# EAGLE schematic 6502_nes_book (EAGLE 6.4), part 5 of 5
## Sheet 27 of 29
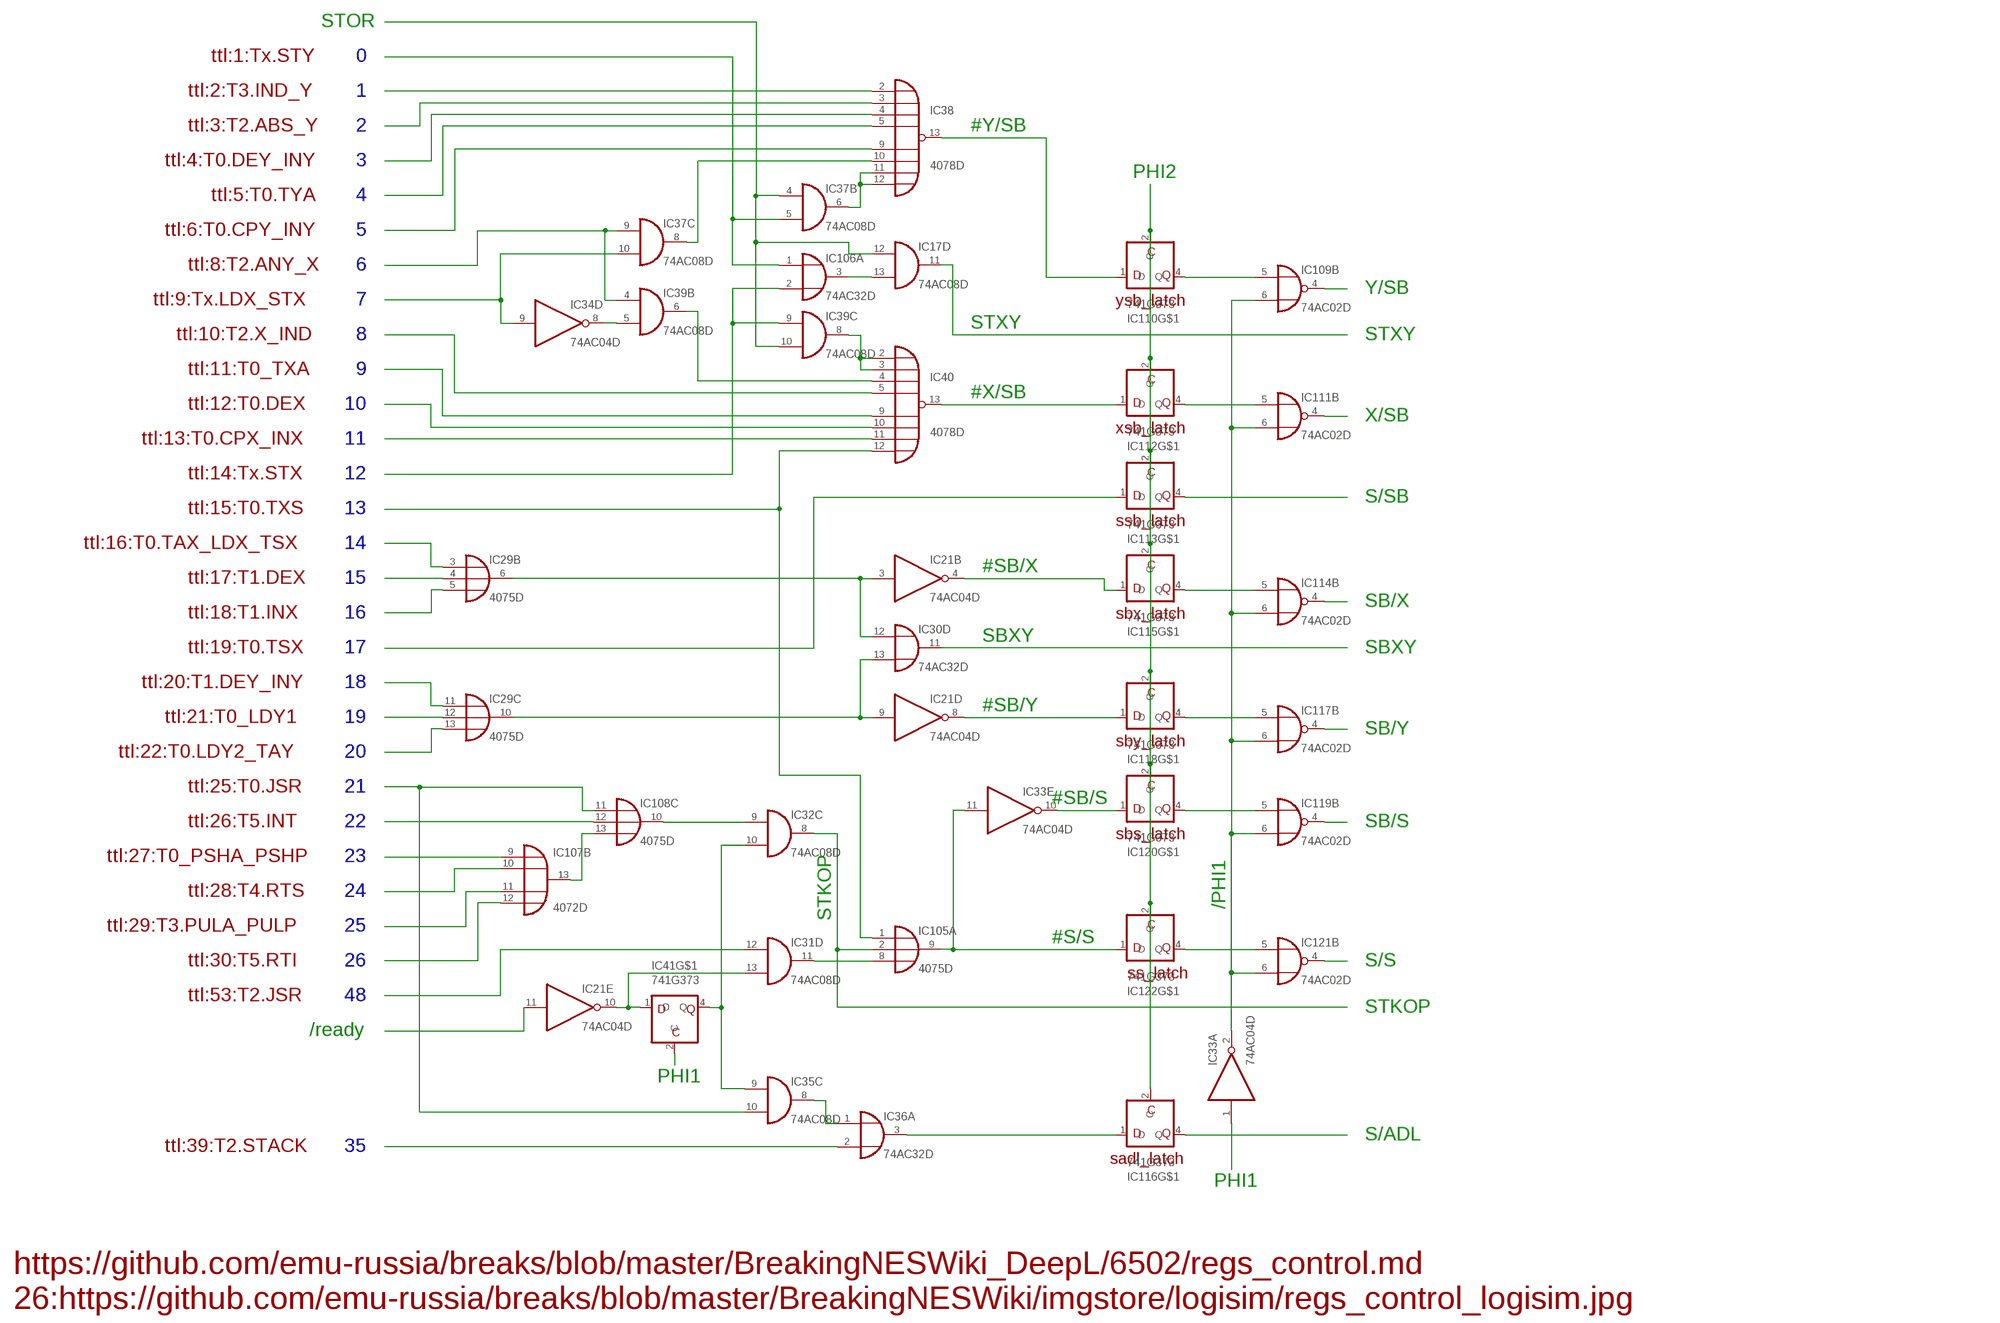
[diagram p35: schematic, sheet 27]

### Parts
IC17  74AC08D  [SO14]
IC21  74AC04D  [SO14]
IC29  4075D  [SO14]
IC30  74AC32D  [SO14]
IC31  74AC08D  [SO14]
IC32  74AC08D  [SO14]
IC33  74AC04D  [SO14]
IC34  74AC04D  [SO14]
IC35  74AC08D  [SO14]
IC36  74AC32D  [SO14]
IC37  74AC08D  [SO14]
IC38  4078D  [SO14]
IC39  74AC08D  [SO14]
IC40  4078D  [SO14]
IC41  741G373  [DBV-R-PDSO-G5]
IC105  4075D  [SO14]
IC106  74AC32D  [SO14]
IC107  4072D  [SO14]
IC108  4075D  [SO14]
IC109  74AC02D  [SO14]
IC110  741G373  [DBV-R-PDSO-G5]
IC111  74AC02D  [SO14]
IC112  741G373  [DBV-R-PDSO-G5]
IC113  741G373  [DBV-R-PDSO-G5]
IC114  74AC02D  [SO14]
IC115  741G373  [DBV-R-PDSO-G5]
IC116  741G373  [DBV-R-PDSO-G5]
IC117  74AC02D  [SO14]
IC118  741G373  [DBV-R-PDSO-G5]
IC119  74AC02D  [SO14]
IC120  741G373  [DBV-R-PDSO-G5]
IC121  74AC02D  [SO14]
IC122  741G373  [DBV-R-PDSO-G5]

### Nets
N$29: IC38.2(I0)
N$33: IC38.3(I1)
N$36: IC38.5(I3)
N$38: IC38.9(I4)
N$39: IC34.9(D:I) IC37.10(C:I1)
N$42: IC34.8(D:O) IC39.5(B:I1)
N$45: IC37.9(C:I0) IC39.4(B:I0)
N$49: IC40.5(I3)
N$50: IC40.9(I4)
N$51: IC40.10(I5)
N$52: IC40.11(I6)
N$53: IC29.3(B:I0)
N$54: IC29.4(B:I1)
N$55: IC29.5(B:I2)
N$56: IC29.13(C:I2)
N$57: IC29.12(C:I1)
N$58: IC29.11(C:I0)
N$59: IC108.12(C:I1)
N$60: IC107.9(B:I0)
N$61: IC35.10(C:I1) IC108.11(C:I0)
N$62: IC107.11(B:I2)
N$63: IC107.10(B:I1)
N$64: IC21.3(B:I) IC29.6(B:O) IC30.12(D:I0)
N$65: IC21.9(D:I) IC29.10(C:O) IC30.13(D:I1)
N$66: IC113.1(D)
N$67: IC36.2(A:I1)
N$68: IC36.3(A:O) IC116.1(D)
N$201: IC31.11(D:O) IC105.8(A:I2)
N$202: IC33.11(E:I) IC105.9(A:O) IC122.1(D)
N$203: IC41.2(C)
N$204: IC32.10(C:I1) IC35.9(C:I0) IC41.4(Q)
N$205: IC33.10(E:O) IC120.1(D)
N$206: IC35.8(C:O) IC36.1(A:I0)
N$207: IC38.13(J) IC110.1(D)
N$208: IC37.6(B:O) IC38.11(I6) IC38.12(I7)
N$209: IC37.8(C:O) IC38.10(I5)
N$210: IC40.13(J) IC112.1(D)
N$211: IC32.9(C:I0) IC108.10(C:O)
N$212: IC21.10(E:O) IC31.13(D:I1) IC41.1(D)
N$213: IC40.12(I7) IC105.1(A:I0)
N$214: IC21.4(B:O) IC115.1(D)
N$215: IC21.8(D:O) IC118.1(D)
N$216: IC31.12(D:I0)
N$217: IC37.5(B:I1) IC106.1(A:I0)
N$218: IC39.9(C:I0) IC106.2(A:I1)
N$219: IC17.13(D:I1) IC106.3(A:O)
N$220: IC39.8(C:O) IC40.2(I0) IC40.3(I1)
N$221: IC39.6(B:O) IC40.4(I2)
N$222: IC107.12(B:I3)
N$223: IC21.11(E:I)
N$224: IC107.13(B:O) IC108.13(C:I2)
N$225: IC30.11(D:O)
N$226: IC32.8(C:O) IC105.2(A:I1)
N$227: IC17.12(D:I0) IC37.4(B:I0) IC39.10(C:I1)
N$228: IC38.4(I2)
N$229: IC109.5(B:I0) IC110.4(Q)
N$230: IC109.4(B:O)
N$231: IC111.5(B:I0) IC112.4(Q)
N$232: IC111.4(B:O)
N$233: IC114.5(B:I0) IC115.4(Q)
N$234: IC114.4(B:O)
N$235: IC116.4(Q)
N$236: IC117.5(B:I0) IC118.4(Q)
N$237: IC117.4(B:O)
N$238: IC119.5(B:I0) IC120.4(Q)
N$239: IC119.4(B:O)
N$240: IC121.5(B:I0) IC122.4(Q)
N$241: IC121.4(B:O)
N$242: IC113.4(Q)
N$243: IC110.2(C) IC112.2(C) IC113.2(C) IC115.2(C) IC116.2(C) IC118.2(C) IC120.2(C) IC122.2(C)
N$244: IC17.11(D:O)
N$272: IC33.2(A:O) IC109.6(B:I1) IC111.6(B:I1) IC114.6(B:I1) IC117.6(B:I1) IC119.6(B:I1) IC121.6(B:I1)
N$273: IC33.1(A:I)
Unconnected: IC17.1(A:I0) IC17.2(A:I1) IC17.3(A:O) IC17.4(B:I0) IC17.5(B:I1) IC17.6(B:O) IC17.8(C:O) IC17.9(C:I0) IC17.10(C:I1) IC21.1(A:I) IC21.2(A:O) IC21.5(C:I) IC21.6(C:O) IC21.12(F:O) IC21.13(F:I) IC29.1(A:I0) IC29.2(A:I1) IC29.8(A:I2) IC29.9(A:O) IC30.1(A:I0) IC30.2(A:I1) IC30.3(A:O) IC30.4(B:I0) IC30.5(B:I1) IC30.6(B:O) IC30.8(C:O) IC30.9(C:I0) IC30.10(C:I1) IC31.1(A:I0) IC31.2(A:I1) IC31.3(A:O) IC31.4(B:I0) IC31.5(B:I1) IC31.6(B:O) IC31.8(C:O) IC31.9(C:I0) IC31.10(C:I1) IC32.1(A:I0) IC32.2(A:I1) IC32.3(A:O) IC32.4(B:I0) IC32.5(B:I1) IC32.6(B:O) IC32.11(D:O) IC32.12(D:I0) IC32.13(D:I1) IC33.3(B:I) IC33.4(B:O) IC33.5(C:I) IC33.6(C:O) IC33.8(D:O) IC33.9(D:I) IC33.12(F:O) IC33.13(F:I) IC34.1(A:I) IC34.2(A:O) IC34.3(B:I) IC34.4(B:O) IC34.5(C:I) IC34.6(C:O) IC34.10(E:O) IC34.11(E:I) IC34.12(F:O) IC34.13(F:I) IC35.1(A:I0) IC35.2(A:I1) IC35.3(A:O) IC35.4(B:I0) IC35.5(B:I1) IC35.6(B:O) IC35.11(D:O) IC35.12(D:I0) IC35.13(D:I1) IC36.4(B:I0) IC36.5(B:I1) IC36.6(B:O) IC36.8(C:O) IC36.9(C:I0) IC36.10(C:I1) IC36.11(D:O) IC36.12(D:I0) IC36.13(D:I1) IC37.1(A:I0) IC37.2(A:I1) IC37.3(A:O) IC37.11(D:O) IC37.12(D:I0) IC37.13(D:I1) IC39.1(A:I0) IC39.2(A:I1) IC39.3(A:O) IC39.11(D:O) IC39.12(D:I0) IC39.13(D:I1) IC105.3(B:I0) IC105.4(B:I1) IC105.5(B:I2) IC105.6(B:O) IC105.10(C:O) IC105.11(C:I0) IC105.12(C:I1) IC105.13(C:I2) IC106.4(B:I0) IC106.5(B:I1) IC106.6(B:O) IC106.8(C:O) IC106.9(C:I0) IC106.10(C:I1) IC106.11(D:O) IC106.12(D:I0) IC106.13(D:I1) IC107.1(A:O) IC107.2(A:I0) IC107.3(A:I1) IC107.4(A:I2) IC107.5(A:I3) IC108.1(A:I0) IC108.2(A:I1) IC108.3(B:I0) IC108.4(B:I1) IC108.5(B:I2) IC108.6(B:O) IC108.8(A:I2) IC108.9(A:O) IC109.1(A:O) IC109.2(A:I0) IC109.3(A:I1) IC109.8(C:I0) IC109.9(C:I1) IC109.10(C:O) IC109.11(D:I0) IC109.12(D:I1) IC109.13(D:O) IC111.1(A:O) IC111.2(A:I0) IC111.3(A:I1) IC111.8(C:I0) IC111.9(C:I1) IC111.10(C:O) IC111.11(D:I0) IC111.12(D:I1) IC111.13(D:O) IC114.1(A:O) IC114.2(A:I0) IC114.3(A:I1) IC114.8(C:I0) IC114.9(C:I1) IC114.10(C:O) IC114.11(D:I0) IC114.12(D:I1) IC114.13(D:O) IC117.1(A:O) IC117.2(A:I0) IC117.3(A:I1) IC117.8(C:I0) IC117.9(C:I1) IC117.10(C:O) IC117.11(D:I0) IC117.12(D:I1) IC117.13(D:O) IC119.1(A:O) IC119.2(A:I0) IC119.3(A:I1) IC119.8(C:I0) IC119.9(C:I1) IC119.10(C:O) IC119.11(D:I0) IC119.12(D:I1) IC119.13(D:O) IC121.1(A:O) IC121.2(A:I0) IC121.3(A:I1) IC121.8(C:I0) IC121.9(C:I1) IC121.10(C:O) IC121.11(D:I0) IC121.12(D:I1) IC121.13(D:O)

### Notes on the sheet
- STOR
- ttl:1:Tx.STY | 0
- ttl:2:T3.IND_Y | 1
- ttl:3:T2.ABS_Y | 2 | #Y/SB
- ttl:4:T0.DEY_INY | 3
- PHI2
- ttl:5:T0.TYA | 4
- ttl:6:T0.CPY_INY | 5
- ttl:8:T2.ANY_X | 6
- Y/SB
- ttl:9:Tx.LDX_STX | 7 | ysb_latch
- STXY
- ttl:10:T2.X_IND | 8 | STXY
- ttl:11:T0_TXA | 9
- #X/SB
- ttl:12:T0.DEX | 10
- X/SB
- xsb_latch
- ttl:13:T0.CPX_INX | 11
- ttl:14:Tx.STX | 12
- S/SB
- ttl:15:T0.TXS | 13
- ssb_latch
- ttl:16:T0.TAX_LDX_TSX | 14
- #SB/X
- ttl:17:T1.DEX | 15
- SB/X
- ttl:18:T1.INX | 16 | sbx_latch
- SBXY
- ttl:19:T0.TSX | 17 | SBXY
- ttl:20:T1.DEY_INY | 18
- #SB/Y
- ttl:21:T0_LDY1 | 19
- SB/Y
- sby_latch
- ttl:22:T0.LDY2_TAY | 20
- ttl:25:T0.JSR | 21
- #SB/S
- ttl:26:T5.INT | 22 | SB/S
- sbs_latch
- ttl:27:T0_PSHA_PSHP | 23
- ttl:28:T4.RTS | 24
- /PHI1
- STKOP
- ttl:29:T3.PULA_PULP | 25
- #S/S
- ttl:30:T5.RTI | 26 | S/S
- ss_latch
- ttl:53:T2.JSR | 48
- STKOP
- /ready
- PHI1
- S/ADL
- ttl:39:T2.STACK | 35
- sadl_latch
- PHI1
- https://github.com/emu-russia/breaks/blob/master/BreakingNESWiki_DeepL/6502/regs_control.md
  26:https://github.com/emu-russia/breaks/blob/master/BreakingNESWiki/imgstore/logisim/regs_control_logisim.jpg

## Sheet 28 of 29
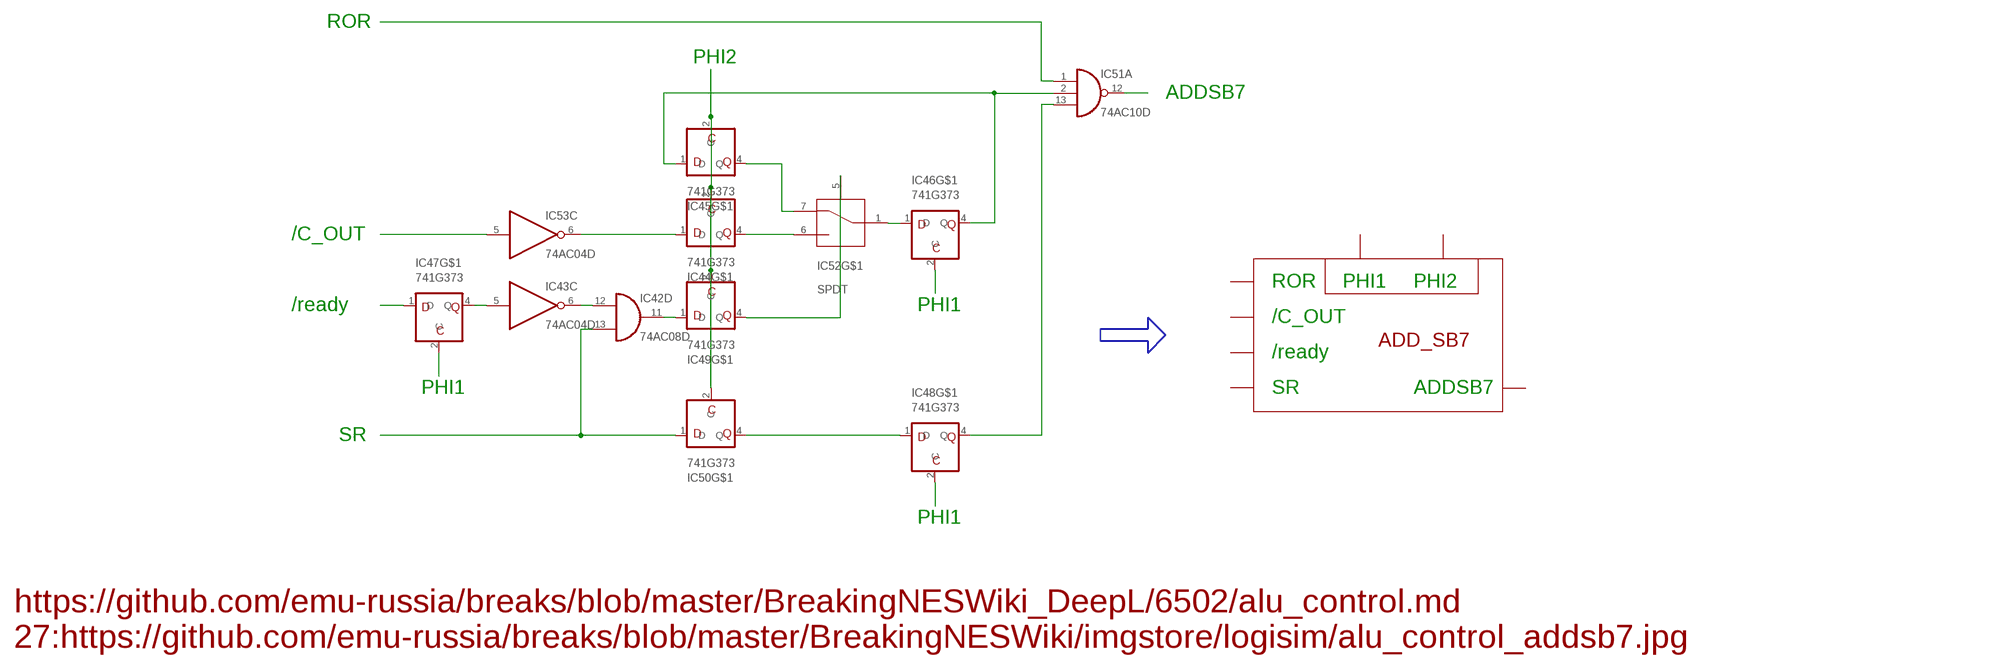
[diagram p36: schematic, sheet 28]

### Parts
IC42  74AC08D  [SO14]
IC43  74AC04D  [SO14]
IC44  741G373  [DBV-R-PDSO-G5]
IC45  741G373  [DBV-R-PDSO-G5]
IC46  741G373  [DBV-R-PDSO-G5]
IC47  741G373  [DBV-R-PDSO-G5]
IC48  741G373  [DBV-R-PDSO-G5]
IC49  741G373  [DBV-R-PDSO-G5]
IC50  741G373  [DBV-R-PDSO-G5]
IC51  74AC10D  [SO14]
IC52  SPDT  [SO8]
IC53  74AC04D  [SO14]

### Nets
N$69: IC51.12(A:O)
N$70: IC45.1(D) IC46.4(Q) IC51.2(A:I1)
N$71: IC51.1(A:I0)
N$72: IC44.2(C) IC45.2(C) IC49.2(C) IC50.2(C)
N$73: IC44.4(Q) IC52.6(NO)
N$74: IC44.1(D) IC53.6(C:O)
N$75: IC42.11(D:O) IC49.1(D)
N$76: IC49.4(Q) IC52.5(A)
N$77: IC47.2(C)
N$78: IC46.2(C)
N$79: IC46.1(D) IC52.1(Q)
N$80: IC45.4(Q) IC52.7(NC)
N$81: IC48.4(Q) IC51.13(A:I2)
N$82: IC48.2(C)
N$83: IC48.1(D) IC50.4(Q)
N$84: IC47.1(D)
N$85: IC42.12(D:I0) IC43.6(C:O)
N$86: IC43.5(C:I) IC47.4(Q)
N$87: IC42.13(D:I1) IC50.1(D)
N$88: IC53.5(C:I)
Unconnected: IC42.1(A:I0) IC42.2(A:I1) IC42.3(A:O) IC42.4(B:I0) IC42.5(B:I1) IC42.6(B:O) IC42.8(C:O) IC42.9(C:I0) IC42.10(C:I1) IC43.1(A:I) IC43.2(A:O) IC43.3(B:I) IC43.4(B:O) IC43.8(D:O) IC43.9(D:I) IC43.10(E:O) IC43.11(E:I) IC43.12(F:O) IC43.13(F:I) IC51.3(B:I0) IC51.4(B:I1) IC51.5(B:I2) IC51.6(B:O) IC51.8(C:O) IC51.9(C:I0) IC51.10(C:I1) IC51.11(C:I2) IC53.1(A:I) IC53.2(A:O) IC53.3(B:I) IC53.4(B:O) IC53.8(D:O) IC53.9(D:I) IC53.10(E:O) IC53.11(E:I) IC53.12(F:O) IC53.13(F:I)

### Buses
B$12

### Notes on the sheet
- ROR
- PHI2
- ADDSB7
- /C_OUT
- ROR | PHI1 | PHI2
- /ready | PHI1
- /C_OUT
- ADD_SB7
- /ready
- PHI1 | SR | ADDSB7
- SR
- PHI1
- https://github.com/emu-russia/breaks/blob/master/BreakingNESWiki_DeepL/6502/alu_control.md
  27:https://github.com/emu-russia/breaks/blob/master/BreakingNESWiki/imgstore/logisim/alu_control_addsb7.jpg

## Sheet 29 of 29
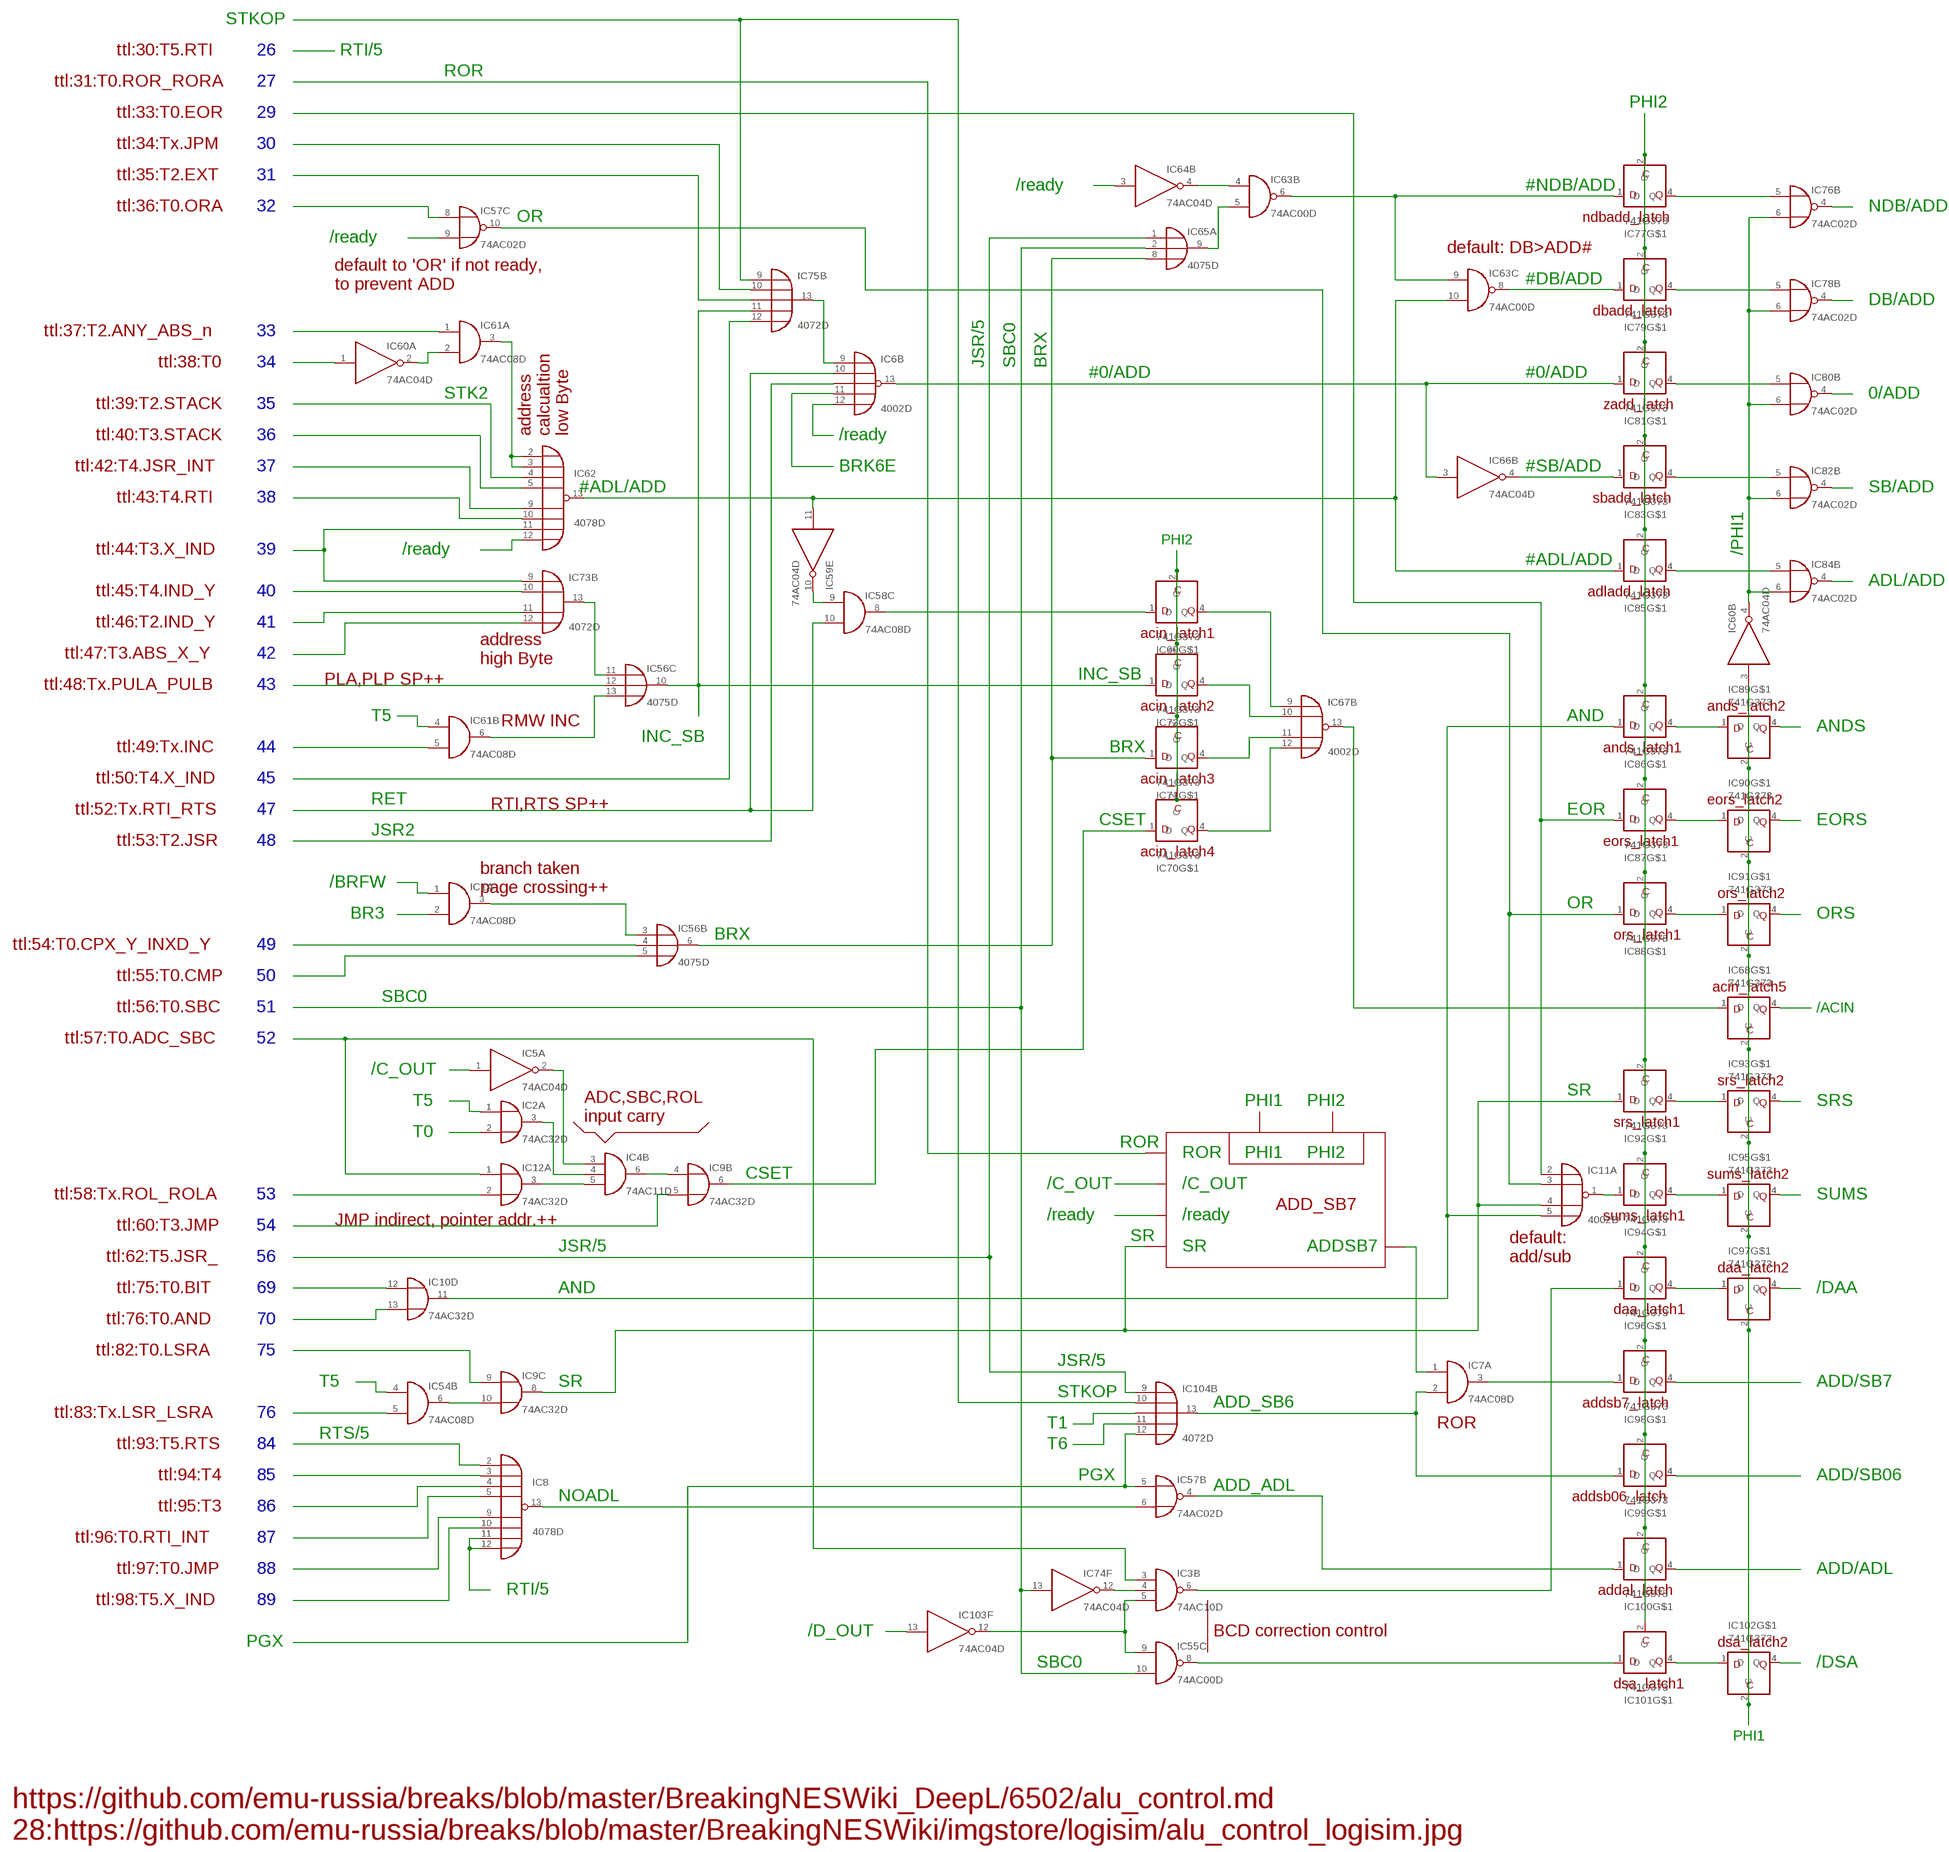
[diagram p37: schematic, sheet 29]

### Parts
IC1  74AC08D  [SO14]
IC2  74AC32D  [SO14]
IC3  74AC10D  [SO14]
IC4  74AC11D  [SO14]
IC5  74AC04D  [SO14]
IC6  4002D  [SO14]
IC7  74AC08D  [SO14]
IC8  4078D  [SO14]
IC9  74AC32D  [SO14]
IC10  74AC32D  [SO14]
IC11  4002D  [SO14]
IC12  74AC32D  [SO14]
IC54  74AC08D  [SO14]
IC55  74AC00D  [SO14]
IC56  4075D  [SO14]
IC57  74AC02D  [SO14]
IC58  74AC08D  [SO14]
IC59  74AC04D  [SO14]
IC60  74AC04D  [SO14]
IC61  74AC08D  [SO14]
IC62  4078D  [SO14]
IC63  74AC00D  [SO14]
IC64  74AC04D  [SO14]
IC65  4075D  [SO14]
IC66  74AC04D  [SO14]
IC67  4002D  [SO14]
IC68  741G373  [DBV-R-PDSO-G5]
IC69  741G373  [DBV-R-PDSO-G5]
IC70  741G373  [DBV-R-PDSO-G5]
IC71  741G373  [DBV-R-PDSO-G5]
IC72  741G373  [DBV-R-PDSO-G5]
IC73  4072D  [SO14]
IC74  74AC04D  [SO14]
IC75  4072D  [SO14]
IC76  74AC02D  [SO14]
IC77  741G373  [DBV-R-PDSO-G5]
IC78  74AC02D  [SO14]
IC79  741G373  [DBV-R-PDSO-G5]
IC80  74AC02D  [SO14]
IC81  741G373  [DBV-R-PDSO-G5]
IC82  74AC02D  [SO14]
IC83  741G373  [DBV-R-PDSO-G5]
IC84  74AC02D  [SO14]
IC85  741G373  [DBV-R-PDSO-G5]
IC86  741G373  [DBV-R-PDSO-G5]
IC87  741G373  [DBV-R-PDSO-G5]
IC88  741G373  [DBV-R-PDSO-G5]
IC89  741G373  [DBV-R-PDSO-G5]
IC90  741G373  [DBV-R-PDSO-G5]
IC91  741G373  [DBV-R-PDSO-G5]
IC92  741G373  [DBV-R-PDSO-G5]
IC93  741G373  [DBV-R-PDSO-G5]
IC94  741G373  [DBV-R-PDSO-G5]
IC95  741G373  [DBV-R-PDSO-G5]
IC96  741G373  [DBV-R-PDSO-G5]
IC97  741G373  [DBV-R-PDSO-G5]
IC98  741G373  [DBV-R-PDSO-G5]
IC99  741G373  [DBV-R-PDSO-G5]
IC100  741G373  [DBV-R-PDSO-G5]
IC101  741G373  [DBV-R-PDSO-G5]
IC102  741G373  [DBV-R-PDSO-G5]
IC103  74AC04D  [SO14]
IC104  4072D  [SO14]

### Nets
N$3: IC60.4(B:O) IC76.6(B:I1) IC78.6(B:I1) IC80.6(B:I1) IC82.6(B:I1) IC84.6(B:I1)
N$6: IC8.9(I4)
N$7: IC8.5(I3)
N$8: IC8.4(I2)
N$9: IC8.3(I1)
N$10: IC8.2(I0)
N$11: IC8.10(I5)
N$12: IC1.3(A:O) IC56.3(B:I0)
N$13: IC4.3(B:I0) IC5.2(A:O)
N$14: IC2.3(A:O) IC4.4(B:I1)
N$15: IC2.2(A:I1)
N$16: IC3.3(B:I0) IC12.1(A:I0)
N$17: IC10.13(D:I1)
N$18: IC10.12(D:I0)
N$19: IC9.9(C:I0)
N$20: IC54.5(B:I1)
N$31: IC4.6(B:O) IC9.4(B:I0)
N$47: IC9.5(B:I1)
N$89: IC57.5(B:I0) IC104.12(B:I3)
N$90: IC3.5(B:I2) IC55.9(C:I0) IC103.12(F:O)
N$91: IC3.6(B:O) IC96.1(D)
N$92: IC55.8(C:O) IC101.1(D)
N$93: IC4.5(B:I2) IC12.3(A:O)
N$94: IC9.10(C:I1) IC54.6(B:O)
N$95: IC59.11(E:I) IC62.13(J) IC63.10(C:I1) IC85.1(D)
N$96: IC60.1(A:I)
N$97: IC62.5(I3)
N$98: IC62.9(I4)
N$99: IC62.10(I5)
N$100: IC73.10(B:I1)
N$101: IC73.11(B:I2)
N$102: IC73.12(B:I3)
N$103: IC56.12(C:I1)
N$104: IC61.5(B:I1)
N$105: IC60.2(A:O) IC61.2(A:I1)
N$106: IC61.1(A:I0)
N$107: IC57.8(C:I0)
N$109: IC75.10(B:I1)
N$110: IC75.12(B:I3)
N$112: IC56.5(B:I2)
N$113: IC56.4(B:I1)
N$114: IC62.12(I7)
N$115: IC11.2(A:I0) IC87.1(D)
N$116: IC69.2(C) IC70.2(C) IC71.2(C) IC72.2(C)
N$117: IC56.10(C:O) IC72.1(D) IC75.11(B:I2)
N$118: IC67.12(B:I3) IC70.4(Q)
N$119: IC67.10(B:I1) IC72.4(Q)
N$120: IC67.11(B:I2) IC71.4(Q)
N$121: IC67.9(B:I0) IC69.4(Q)
N$122: IC67.13(B:O) IC68.1(D)
N$123: IC9.6(B:O) IC70.1(D)
N$124: IC56.6(B:O) IC65.8(A:I2) IC71.1(D)
N$125: IC63.6(B:O) IC63.9(C:I0) IC77.1(D)
N$126: IC63.4(B:I0) IC64.4(B:O)
N$127: IC64.3(B:I)
N$128: IC8.13(J) IC57.6(B:I1)
N$130: IC63.8(C:O) IC79.1(D)
N$131: IC6.13(B:O) IC66.3(B:I) IC81.1(D)
N$132: IC66.4(B:O) IC83.1(D)
N$133: IC10.11(D:O) IC11.5(A:I3) IC86.1(D)
N$134: IC11.3(A:I1) IC57.10(C:O) IC88.1(D)
N$135: IC68.4(Q)
N$136: IC57.9(C:I1)
N$137: IC61.3(A:O) IC62.2(I0) IC62.3(I1)
N$138: IC56.13(C:I2) IC61.6(B:O)
N$139: IC63.5(B:I1) IC65.9(A:O)
N$140: IC58.9(C:I0) IC59.10(E:O)
N$141: IC56.11(C:I0) IC73.13(B:O)
N$143: IC3.4(B:I1) IC74.12(F:O)
N$144: IC65.1(A:I0) IC104.9(B:I0)
N$145: IC62.4(I2)
N$146: IC55.10(C:I1) IC65.2(A:I1) IC74.13(F:I)
N$147: IC1.2(A:I1)
N$148: IC1.1(A:I0)
N$149: IC12.2(A:I1)
N$150: IC62.11(I6) IC73.9(B:I0)
N$151: IC58.8(C:O) IC69.1(D)
N$152: IC6.10(B:I1) IC58.10(C:I1)
N$153: IC6.9(B:I0) IC75.13(B:O)
N$154: IC9.8(C:O) IC11.4(A:I2) IC92.1(D)
N$155: IC61.4(B:I0)
N$156: IC76.5(B:I0) IC77.4(Q)
N$157: IC76.4(B:O)
N$158: IC78.5(B:I0) IC79.4(Q)
N$159: IC78.4(B:O)
N$160: IC80.5(B:I0) IC81.4(Q)
N$161: IC80.4(B:O)
N$162: IC82.5(B:I0) IC83.4(Q)
N$163: IC82.4(B:O)
N$164: IC84.5(B:I0) IC85.4(Q)
N$165: IC84.4(B:O)
N$166: IC77.2(C) IC79.2(C) IC81.2(C) IC83.2(C) IC85.2(C) IC86.2(C) IC87.2(C) IC88.2(C) IC92.2(C) IC94.2(C) IC96.2(C) IC98.2(C) IC99.2(C) IC100.2(C) IC101.2(C)
N$167: IC6.11(B:I2)
N$168: IC88.4(Q) IC91.1(D)
N$169: IC87.4(Q) IC90.1(D)
N$170: IC86.4(Q) IC89.1(D)
N$171: IC89.4(Q)
N$172: IC90.4(Q)
N$173: IC91.4(Q)
N$174: IC2.1(A:I0)
N$175: IC5.1(A:I)
N$176: IC54.4(B:I0)
N$177: IC8.11(I6) IC8.12(I7)
N$178: IC92.4(Q) IC93.1(D)
N$179: IC93.4(Q)
N$180: IC94.4(Q) IC95.1(D)
N$181: IC95.4(Q)
N$182: IC96.4(Q) IC97.1(D)
N$183: IC97.4(Q)
N$184: IC101.4(Q) IC102.1(D)
N$185: IC102.4(Q)
N$186: IC98.4(Q)
N$187: IC99.4(Q)
N$188: IC100.4(Q)
N$189: IC103.13(F:I)
N$190: IC57.4(B:O) IC100.1(D)
N$191: IC7.2(A:I1) IC99.1(D) IC104.13(B:O)
N$192: IC75.9(B:I0) IC104.10(B:I1)
N$194: IC104.11(B:I2)
N$195: IC7.3(A:O) IC98.1(D)
N$198: IC7.1(A:I0)
N$199: IC11.1(A:O) IC94.1(D)
N$200: IC60.3(B:I) IC68.2(C) IC89.2(C) IC90.2(C) IC91.2(C) IC93.2(C) IC95.2(C) IC97.2(C) IC102.2(C)
NNET9: IC6.12(B:I3)
Unconnected: IC1.4(B:I0) IC1.5(B:I1) IC1.6(B:O) IC1.8(C:O) IC1.9(C:I0) IC1.10(C:I1) IC1.11(D:O) IC1.12(D:I0) IC1.13(D:I1) IC2.4(B:I0) IC2.5(B:I1) IC2.6(B:O) IC2.8(C:O) IC2.9(C:I0) IC2.10(C:I1) IC2.11(D:O) IC2.12(D:I0) IC2.13(D:I1) IC3.1(A:I0) IC3.2(A:I1) IC3.8(C:O) IC3.9(C:I0) IC3.10(C:I1) IC3.11(C:I2) IC3.12(A:O) IC3.13(A:I2) IC4.1(A:I0) IC4.2(A:I1) IC4.8(C:O) IC4.9(C:I0) IC4.10(C:I1) IC4.11(C:I2) IC4.12(A:O) IC4.13(A:I2) IC5.3(B:I) IC5.4(B:O) IC5.5(C:I) IC5.6(C:O) IC5.8(D:O) IC5.9(D:I) IC5.10(E:O) IC5.11(E:I) IC5.12(F:O) IC5.13(F:I) IC6.1(A:O) IC6.2(A:I0) IC6.3(A:I1) IC6.4(A:I2) IC6.5(A:I3) IC7.4(B:I0) IC7.5(B:I1) IC7.6(B:O) IC7.8(C:O) IC7.9(C:I0) IC7.10(C:I1) IC7.11(D:O) IC7.12(D:I0) IC7.13(D:I1) IC9.1(A:I0) IC9.2(A:I1) IC9.3(A:O) IC9.11(D:O) IC9.12(D:I0) IC9.13(D:I1) IC10.1(A:I0) IC10.2(A:I1) IC10.3(A:O) IC10.4(B:I0) IC10.5(B:I1) IC10.6(B:O) IC10.8(C:O) IC10.9(C:I0) IC10.10(C:I1) IC11.9(B:I0) IC11.10(B:I1) IC11.11(B:I2) IC11.12(B:I3) IC11.13(B:O) IC12.4(B:I0) IC12.5(B:I1) IC12.6(B:O) IC12.8(C:O) IC12.9(C:I0) IC12.10(C:I1) IC12.11(D:O) IC12.12(D:I0) IC12.13(D:I1) IC54.1(A:I0) IC54.2(A:I1) IC54.3(A:O) IC54.8(C:O) IC54.9(C:I0) IC54.10(C:I1) IC54.11(D:O) IC54.12(D:I0) IC54.13(D:I1) IC55.1(A:I0) IC55.2(A:I1) IC55.3(A:O) IC55.4(B:I0) IC55.5(B:I1) IC55.6(B:O) IC55.11(D:O) IC55.12(D:I0) IC55.13(D:I1) IC56.1(A:I0) IC56.2(A:I1) IC56.8(A:I2) IC56.9(A:O) IC57.1(A:O) IC57.2(A:I0) IC57.3(A:I1) IC57.11(D:I0) IC57.12(D:I1) IC57.13(D:O) IC58.1(A:I0) IC58.2(A:I1) IC58.3(A:O) IC58.4(B:I0) IC58.5(B:I1) IC58.6(B:O) IC58.11(D:O) IC58.12(D:I0) IC58.13(D:I1) IC59.1(A:I) IC59.2(A:O) IC59.3(B:I) IC59.4(B:O) IC59.5(C:I) IC59.6(C:O) IC59.8(D:O) IC59.9(D:I) IC59.12(F:O) IC59.13(F:I) IC60.5(C:I) IC60.6(C:O) IC60.8(D:O) IC60.9(D:I) IC60.10(E:O) IC60.11(E:I) IC60.12(F:O) IC60.13(F:I) IC61.8(C:O) IC61.9(C:I0) IC61.10(C:I1) IC61.11(D:O) IC61.12(D:I0) IC61.13(D:I1) IC63.1(A:I0) IC63.2(A:I1) IC63.3(A:O) IC63.11(D:O) IC63.12(D:I0) IC63.13(D:I1) IC64.1(A:I) IC64.2(A:O) IC64.5(C:I) IC64.6(C:O) IC64.8(D:O) IC64.9(D:I) IC64.10(E:O) IC64.11(E:I) IC64.12(F:O) IC64.13(F:I) IC65.3(B:I0) IC65.4(B:I1) IC65.5(B:I2) IC65.6(B:O) IC65.10(C:O) IC65.11(C:I0) IC65.12(C:I1) IC65.13(C:I2) IC66.1(A:I) IC66.2(A:O) IC66.5(C:I) IC66.6(C:O) IC66.8(D:O) IC66.9(D:I) IC66.10(E:O) IC66.11(E:I) IC66.12(F:O) IC66.13(F:I) IC67.1(A:O) IC67.2(A:I0) IC67.3(A:I1) IC67.4(A:I2) IC67.5(A:I3) IC73.1(A:O) IC73.2(A:I0) IC73.3(A:I1) IC73.4(A:I2) IC73.5(A:I3) IC74.1(A:I) IC74.2(A:O) IC74.3(B:I) IC74.4(B:O) IC74.5(C:I) IC74.6(C:O) IC74.8(D:O) IC74.9(D:I) IC74.10(E:O) IC74.11(E:I) IC75.1(A:O) IC75.2(A:I0) IC75.3(A:I1) IC75.4(A:I2) IC75.5(A:I3) IC76.1(A:O) IC76.2(A:I0) IC76.3(A:I1) IC76.8(C:I0) IC76.9(C:I1) IC76.10(C:O) IC76.11(D:I0) IC76.12(D:I1) IC76.13(D:O) IC78.1(A:O) IC78.2(A:I0) IC78.3(A:I1) IC78.8(C:I0) IC78.9(C:I1) IC78.10(C:O) IC78.11(D:I0) IC78.12(D:I1) IC78.13(D:O) IC80.1(A:O) IC80.2(A:I0) IC80.3(A:I1) IC80.8(C:I0) IC80.9(C:I1) IC80.10(C:O) IC80.11(D:I0) IC80.12(D:I1) IC80.13(D:O) IC82.1(A:O) IC82.2(A:I0) IC82.3(A:I1) IC82.8(C:I0) IC82.9(C:I1) IC82.10(C:O) IC82.11(D:I0) IC82.12(D:I1) IC82.13(D:O) IC84.1(A:O) IC84.2(A:I0) IC84.3(A:I1) IC84.8(C:I0) IC84.9(C:I1) IC84.10(C:O) IC84.11(D:I0) IC84.12(D:I1) IC84.13(D:O) IC103.1(A:I) IC103.2(A:O) IC103.3(B:I) IC103.4(B:O) IC103.5(C:I) IC103.6(C:O) IC103.8(D:O) IC103.9(D:I) IC103.10(E:O) IC103.11(E:I) IC104.1(A:O) IC104.2(A:I0) IC104.3(A:I1) IC104.4(A:I2) IC104.5(A:I3)

### Notes on the sheet
- STKOP
- ttl:30:T5.RTI | 26 | RTI/5
- ROR
- ttl:31:T0.ROR_RORA | 27
- PHI2
- ttl:33:T0.EOR | 29
- ttl:34:Tx.JPM | 30
- ttl:35:T2.EXT | 31
- /ready | #NDB/ADD
- ttl:36:T0.ORA | 32 | NDB/ADD
- OR | ndbadd_latch
- /ready
- default: DB>ADD#
- #DB/ADD
- default to 'OR' if not ready,
  to prevent ADD
- DB/ADD
- dbadd_latch
- ttl:37:T2.ANY_ABS_n | 33
- ttl:38:T0 | 34 | JSR/5 | SBC0 | BRX
- #0/ADD | #0/ADD
- STK2 | 0/ADD
- ttl:39:T2.STACK | 35 | zadd_latch
- address
  calcualtion
  low Byte
- ttl:40:T3.STACK | 36 | /ready
- ttl:42:T4.JSR_INT | 37 | BRK6E | #SB/ADD
- #ADL/ADD | SB/ADD
- ttl:43:T4.RTI | 38 | sbadd_latch
- PHI2
- ttl:44:T3.X_IND | 39 | /ready | /PHI1
- #ADL/ADD
- ADL/ADD
- ttl:45:T4.IND_Y | 40 | adladd_latch
- ttl:46:T2.IND_Y | 41
- acin_latch1
- ttl:47:T3.ABS_X_Y | 42
- address
  high Byte
- INC_SB
- PLA,PLP SP++
- ttl:48:Tx.PULA_PULB | 43
- acin_latch2 | ands_latch2
- T5 | AND
- RMW INC
- ANDS
- INC_SB
- ttl:49:Tx.INC | 44 | BRX | ands_latch1
- ttl:50:T4.X_IND | 45 | acin_latch3
- RET | eors_latch2
- RTI,RTS SP++
- ttl:52:Tx.RTI_RTS | 47 | EOR
- CSET | EORS
- JSR2
- ttl:53:T2.JSR | 48 | eors_latch1
- acin_latch4
- /BRFW
- branch taken
  page crossing++
- ors_latch2
- OR
- BR3 | ORS
- BRX | ors_latch1
- ttl:54:T0.CPX_Y_INXD_Y | 49
- ttl:55:T0.CMP | 50
- acin_latch5
- SBC0
- ttl:56:T0.SBC | 51 | /ACIN
- ttl:57:T0.ADC_SBC | 52
- /C_OUT
- srs_latch2
- SR
- T5 | PHI1 | PHI2 | SRS
- ADC,SBC,ROL
  input carry
- srs_latch1
- T0
- ROR
- ROR | PHI1 | PHI2
- CSET | sums_latch2
- /C_OUT | /C_OUT
- ttl:58:Tx.ROL_ROLA | 53 | SUMS
- ADD_SB7
- /ready | /ready | sums_latch1
- JMP indirect, pointer addr.++
- ttl:60:T3.JMP | 54
- SR
- JSR/5 | SR | ADDSB7
- ttl:62:T5.JSR_ | 56
- default:
  add/sub
- daa_latch2
- ttl:75:T0.BIT | 69 | AND | /DAA
- daa_latch1
- ttl:76:T0.AND | 70
- ttl:82:T0.LSRA | 75
- JSR/5
- T5 | SR | ADD/SB7
- STKOP
- ADD_SB6 | addsb7_latch
- ttl:83:Tx.LSR_LSRA | 76
- T1 | ROR
- RTS/5
- ttl:93:T5.RTS | 84 | T6
- ttl:94:T4 | 85 | PGX | ADD/SB06
- ADD_ADL
- NOADL | addsb06_latch
- ttl:95:T3 | 86
- ttl:96:T0.RTI_INT | 87
- ttl:97:T0.JMP | 88 | ADD/ADL
- RTI/5 | addal_latch
- ttl:98:T5.X_IND | 89
- /D_OUT | BCD correction control
- PGX | dsa_latch2
- SBC0 | /DSA
- dsa_latch1
- PHI1
- https://github.com/emu-russia/breaks/blob/master/BreakingNESWiki_DeepL/6502/alu_control.md
  28:https://github.com/emu-russia/breaks/blob/master/BreakingNESWiki/imgstore/logisim/alu_control_logisim.jpg

## Power pins joined to a net without a drawn wire
GND: IC1.7(P:GND) IC2.7(P:GND) IC3.7(P:GND) IC4.7(P:GND) IC5.7(P:GND) IC7.7(P:GND) IC9.7(P:GND) IC10.7(P:GND) IC12.7(P:GND) IC13.7(P:GND) IC14.7(P:GND) IC15.7(P:GND) IC16.7(P:GND) IC17.7(P:GND) IC19.7(P:GND) IC20.7(P:GND) IC21.7(P:GND) IC22.7(P:GND) IC23.7(P:GND) IC26.7(P:GND) IC27.7(P:GND) IC28.7(P:GND) IC30.7(P:GND) IC31.7(P:GND) IC32.7(P:GND) IC33.7(P:GND) IC34.7(P:GND) IC35.7(P:GND) IC36.7(P:GND) IC37.7(P:GND) IC39.7(P:GND) IC41.3(GND) IC42.7(P:GND) IC43.7(P:GND) IC44.3(GND) IC45.3(GND) IC46.3(GND) IC47.3(GND) IC48.3(GND) IC49.3(GND) IC50.3(GND) IC51.7(P:GND) IC52.2(GND) IC52.3(GND) IC52.4(GND) IC53.7(P:GND) IC54.7(P:GND) IC55.7(P:GND) IC57.7(P:GND) IC58.7(P:GND) IC59.7(P:GND) IC60.7(P:GND) IC61.7(P:GND) IC63.7(P:GND) IC64.7(P:GND) IC66.7(P:GND) IC68.3(GND) IC69.3(GND) IC70.3(GND) IC71.3(GND) IC72.3(GND) IC74.7(P:GND) IC76.7(P:GND) IC77.3(GND) IC78.7(P:GND) IC79.3(GND) IC80.7(P:GND) IC81.3(GND) IC82.7(P:GND) IC83.3(GND) IC84.7(P:GND) IC85.3(GND) IC86.3(GND) IC87.3(GND) IC88.3(GND) IC89.3(GND) IC90.3(GND) IC91.3(GND) IC92.3(GND) IC93.3(GND) IC94.3(GND) IC95.3(GND) IC96.3(GND) IC97.3(GND) IC98.3(GND) IC99.3(GND) IC100.3(GND) IC101.3(GND) IC102.3(GND) IC103.7(P:GND) IC106.7(P:GND) IC109.7(P:GND) IC110.3(GND) IC111.7(P:GND) IC112.3(GND) IC113.3(GND) IC114.7(P:GND) IC115.3(GND) IC116.3(GND) IC117.7(P:GND) IC118.3(GND) IC119.7(P:GND) IC120.3(GND) IC121.7(P:GND) IC122.3(GND) IC123.7(P:GND) IC124.7(P:GND) IC125.7(P:GND) IC126.3(GND) IC127.7(P:GND) IC130.7(P:GND) IC131.3(GND) IC133.3(GND) IC141.7(P:GND) IC144.3(GND) IC153.3(GND) IC154.3(GND) IC155.7(P:GND) IC157.3(GND) IC158.3(GND) IC159.3(GND) IC160.3(GND) IC161.3(GND) IC162.7(P:GND) IC163.3(GND) IC164.7(P:GND) IC165.3(GND) IC166.7(P:GND) IC167.3(GND) IC169.7(P:GND) IC189.7(P:GND) IC190.7(P:GND) IC198.7(P:GND) IC5089.7(P:GND) IC5183.7(P:GND) IC5184.7(P:GND) IC5185.7(P:GND) IC5191.7(P:GND) IC5196.7(P:GND) IC5203.7(P:GND) IC5206.3(GND) IC5212.3(GND) IC5217.7(P:GND) IC5220.7(P:GND) IC5231.7(P:GND) IC5234.7(P:GND) IC5240.7(P:GND) IC5242.7(P:GND) IC5247.7(P:GND) IC5252.3(GND) IC5257.3(GND) IC5805.3(GND) IC5808.3(GND) IC5809.3(GND) IC5810.7(P:GND) IC5815.7(P:GND) IC5847.3(GND) IC5968.3(GND) IC5991.3(GND) IC6023.7(P:GND) IC6043.7(P:GND) IC6063.3(GND) IC6075.3(GND) IC6101.3(GND) IC6102.3(GND) IC6103.7(P:GND) IC6105.7(P:GND) IC6106.7(P:GND) IC6107.7(P:GND) IC6108.7(P:GND) IC6109.3(GND) IC6110.3(GND) IC6111.7(P:GND) IC6112.2(GND) IC6112.3(GND) IC6112.4(GND) IC6113.7(P:GND) IC6114.3(GND) IC6115.7(P:GND) IC6116.7(P:GND) IC6125.7(P:GND) IC6126.7(P:GND) IC6127.7(P:GND) IC6128.7(P:GND) IC6129.7(P:GND) IC6130.7(P:GND) IC6131.7(P:GND) IC6132.7(P:GND) IC6134.7(P:GND) IC6135.7(P:GND) IC6140.7(P:GND) IC6141.7(P:GND) IC6142.7(P:GND) IC6143.7(P:GND) IC6144.7(P:GND) IC6145.7(P:GND) IC6146.7(P:GND) IC6147.7(P:GND) IC6148.3(GND) IC6149.3(GND) IC6153.7(P:GND) IC6154.7(P:GND) IC6155.7(P:GND) IC6156.7(P:GND) IC6165.7(P:GND) IC6166.7(P:GND) IC6167.7(P:GND) IC6168.7(P:GND) IC6169.3(GND) IC6170.3(GND) IC6171.7(P:GND) IC6172.7(P:GND) IC6173.7(P:GND) IC6174.7(P:GND) IC6175.7(P:GND) IC6176.7(P:GND) IC6177.7(P:GND) IC6179.7(P:GND) IC6180.7(P:GND) IC6181.7(P:GND) IC6182.7(P:GND) IC6183.7(P:GND) IC6184.7(P:GND) IC6185.7(P:GND) IC6186.7(P:GND) IC6187.7(P:GND) IC6188.3(GND) IC6189.7(P:GND) IC6190.7(P:GND) IC6191.7(P:GND) IC6192.7(P:GND) IC6193.7(P:GND) IC6195.7(P:GND) IC6196.7(P:GND) IC6198.7(P:GND) IC6199.7(P:GND) IC6200.7(P:GND) IC6201.7(P:GND) IC6202.7(P:GND) IC6203.7(P:GND) IC6204.7(P:GND) IC6205.7(P:GND) IC6206.7(P:GND) IC6207.7(P:GND) IC6208.7(P:GND) IC6209.7(P:GND) IC6211.7(P:GND) IC6212.7(P:GND) IC6214.7(P:GND) IC6215.7(P:GND) IC6216.7(P:GND) IC6217.7(P:GND) IC6218.7(P:GND) IC6219.7(P:GND) IC6220.7(P:GND) IC6221.7(P:GND) IC6222.3(GND) IC6223.3(GND) IC6224.7(P:GND) IC6227.7(P:GND) IC6228.7(P:GND) IC6229.7(P:GND) IC6230.7(P:GND) IC6231.7(P:GND) IC6232.7(P:GND) IC6233.7(P:GND) IC6234.7(P:GND) IC6235.7(P:GND) IC6236.3(GND) IC6237.3(GND) IC6238.3(GND) IC6239.7(P:GND) IC6240.7(P:GND) IC6241.7(P:GND) IC6242.7(P:GND) IC6243.7(P:GND) IC6244.7(P:GND) IC6245.7(P:GND) IC6246.3(GND) IC6247.3(GND) IC6248.3(GND) IC6249.7(P:GND) IC6250.7(P:GND) IC6251.7(P:GND) IC6252.7(P:GND) IC6253.7(P:GND) IC6254.7(P:GND) IC6255.3(GND) IC6256.7(P:GND) IC6257.7(P:GND) IC6258.7(P:GND) IC6259.7(P:GND) IC6260.7(P:GND) IC6261.7(P:GND) IC6262.7(P:GND) IC6263.7(P:GND) IC6265.3(GND) IC6266.3(GND) IC6267.2(GND) IC6267.3(GND) IC6267.4(GND) IC6268.7(P:GND) IC6269.7(P:GND) IC6270.7(P:GND) IC6272.3(GND) IC6273.3(GND) IC6274.7(P:GND) IC6275.7(P:GND) IC6276.7(P:GND) IC6277.7(P:GND) IC6279.7(P:GND) IC6280.7(P:GND) IC6281.7(P:GND) IC6282.3(GND) IC6284.7(P:GND) IC6285.3(GND) IC6286.7(P:GND) IC6287.3(GND) IC6288.3(GND) IC6289.7(P:GND) IC6290.3(GND) IC6291.3(GND) IC6292.3(GND) IC6294.3(GND) IC6295.3(GND) IC6296.3(GND) IC6297.3(GND) IC6298.3(GND) IC6299.2(GND) IC6299.3(GND) IC6299.4(GND) IC6300.7(P:GND) IC6301.2(GND) IC6301.3(GND) IC6301.4(GND) IC6302.7(P:GND) IC6303.2(GND) IC6303.3(GND) IC6303.4(GND) IC6304.7(P:GND) IC6305.2(GND) IC6305.3(GND) IC6305.4(GND) IC6306.7(P:GND) IC6307.7(P:GND) IC6308.3(GND) IC6309.7(P:GND) IC6311.3(GND) IC6312.7(P:GND) IC6313.3(GND) IC6314.2(GND) IC6314.3(GND) IC6314.4(GND) IC6316.7(P:GND) IC6317.7(P:GND) IC6318.7(P:GND) IC6319.7(P:GND) IC6320.7(P:GND) IC6321.7(P:GND) IC6322.7(P:GND) IC6323.7(P:GND) IC6324.7(P:GND) IC6325.7(P:GND) IC6326.7(P:GND) IC6328.7(P:GND) IC6329.7(P:GND) IC6330.7(P:GND) IC6331.7(P:GND) IC6332.3(GND) IC6333.7(P:GND) IC6334.3(GND) IC6335.3(GND) IC6336.3(GND) IC6337.7(P:GND) IC6338.3(GND) IC6340.7(P:GND) IC6341.7(P:GND) IC6342.7(P:GND) IC6343.3(GND) IC6344.7(P:GND) IC6345.3(GND) IC6346.3(GND) IC6347.3(GND) IC6348.3(GND) IC6349.3(GND) IC6353.7(P:GND) IC6354.3(GND) IC6355.7(P:GND) IC6356.7(P:GND) IC6357.7(P:GND) IC6358.3(GND) IC6359.3(GND) IC6365.7(P:GND) IC6368.7(P:GND) IC6370.3(GND) IC6371.3(GND) IC6372.3(GND) IC6373.7(P:GND) IC6380.7(P:GND) IC6381.7(P:GND) IC6382.7(P:GND) IC6383.3(GND) IC6387.7(P:GND) IC6390.7(P:GND) IC6391.7(P:GND) IC6392.7(P:GND) IC6393.7(P:GND) IC6394.7(P:GND) IC6395.3(GND) IC6396.7(P:GND) IC6397.7(P:GND) IC6399.7(P:GND) IC6400.7(P:GND) IC6401.7(P:GND) IC6402.7(P:GND) IC6403.7(P:GND) IC6404.7(P:GND) IC6405.7(P:GND) IC6406.7(P:GND) IC6407.7(P:GND) IC6408.7(P:GND) IC6409.3(GND) IC6410.7(P:GND) IC6411.7(P:GND) IC6412.3(GND) IC6413.3(GND) IC6414.7(P:GND) IC6415.3(GND) IC6416.7(P:GND) IC6418.3(GND) IC6419.7(P:GND) IC6420.3(GND) IC6421.7(P:GND) IC6422.3(GND) IC6423.3(GND) IC6424.3(GND) IC6425.3(GND) IC6426.3(GND) IC6427.3(GND) IC6428.7(P:GND) IC6429.7(P:GND) IC6430.7(P:GND) IC6431.7(P:GND) IC6432.3(GND) IC6433.3(GND) IC6434.3(GND) IC6435.3(GND) IC6436.3(GND) IC6437.3(GND) IC6438.7(P:GND) IC6439.7(P:GND) IC6440.7(P:GND) IC6441.7(P:GND) IC6442.3(GND) IC6443.3(GND) IC6444.3(GND) IC6445.3(GND) IC6446.3(GND) IC6447.7(P:GND) IC6449.3(GND) IC6450.7(P:GND) IC6451.7(P:GND) IC6452.3(GND) IC6453.7(P:GND) IC6454.3(GND) IC6455.3(GND) IC6456.3(GND) IC6457.7(P:GND) IC6458.7(P:GND) IC6459.7(P:GND) IC6460.7(P:GND) IC6461.7(P:GND) IC6462.7(P:GND) IC6463.7(P:GND) IC6464.7(P:GND) IC6465.7(P:GND) IC6466.7(P:GND) IC6467.7(P:GND) IC6468.7(P:GND) IC6469.7(P:GND) IC6470.3(GND) IC6471.3(GND) IC6472.3(GND) IC6473.3(GND) IC6474.3(GND) IC6475.3(GND) IC6476.3(GND) IC6477.3(GND) IC6478.7(P:GND) IC6479.7(P:GND) IC6480.3(GND) IC6481.3(GND) IC6482.3(GND) IC6483.3(GND) IC6484.7(P:GND) IC6485.7(P:GND) IC6493.7(P:GND) IC6494.3(GND) IC6507.3(GND) IC6514.3(GND) IC6515.7(P:GND) IC6516.7(P:GND) IC6520.7(P:GND) IC6532.7(P:GND) IC6536.3(GND) IC6537.7(P:GND) IC6538.7(P:GND) IC6547.3(GND) IC6548.3(GND) IC6549.7(P:GND) IC6550.3(GND) IC6552.3(GND) IC6553.7(P:GND) IC6554.3(GND) IC6555.3(GND) IC6556.7(P:GND) IC6557.3(GND) IC6558.7(P:GND) IC6559.3(GND) IC6560.3(GND) IC6561.7(P:GND) IC6562.3(GND) IC6567.7(P:GND) IC6572.7(P:GND) IC6573.7(P:GND) IC6574.7(P:GND) IC6575.7(P:GND) IC6576.7(P:GND) IC6579.7(P:GND) IC6580.7(P:GND) IC6581.7(P:GND) IC6582.7(P:GND) IC6584.7(P:GND) IC6586.7(P:GND) IC6587.7(P:GND) IC6592.7(P:GND) IC6593.7(P:GND) IC6594.7(P:GND) IC6596.7(P:GND) IC6600.7(P:GND) IC6602.7(P:GND) IC6603.7(P:GND) IC6607.3(GND) IC6608.7(P:GND) IC6612.7(P:GND) IC6613.7(P:GND) IC6614.7(P:GND) IC6616.7(P:GND) IC6617.7(P:GND) IC6618.7(P:GND) IC6620.7(P:GND) IC6621.7(P:GND) IC6622.7(P:GND) IC6623.7(P:GND) IC6626.3(GND) IC6627.3(GND) IC6628.3(GND) IC6629.3(GND) IC6630.3(GND) IC6631.3(GND) IC6632.3(GND) IC6633.3(GND) IC6634.3(GND) IC6635.3(GND) IC6636.7(P:GND) IC6638.3(GND) IC6642.7(P:GND) IC6643.3(GND) IC6644.3(GND) IC6645.3(GND) IC6646.3(GND) IC6647.3(GND) IC6648.3(GND) IC6649.3(GND) IC6650.3(GND) IC6651.3(GND) IC6652.3(GND) IC6653.3(GND) IC6655.3(GND) IC6656.3(GND) IC6657.3(GND) IC6658.3(GND) IC6665.7(P:GND) IC6681.3(GND) IC6682.3(GND) IC6691.7(P:GND) IC6706.7(P:GND) IC6707.7(P:GND) IC6719.2(GND) IC6719.3(GND) IC6719.4(GND) IC6747.3(GND) IC6748.7(P:GND) IC6749.7(P:GND) IC6750.7(P:GND) IC6751.7(P:GND) IC6752.7(P:GND) IC6753.3(GND) IC6754.7(P:GND) IC6770.7(P:GND) IC6779.3(GND) IC6786.7(P:GND) IC6787.7(P:GND) IC6796.7(P:GND) IC6797.7(P:GND) IC6798.7(P:GND) IC6799.7(P:GND) IC6800.3(GND) IC6801.3(GND) IC6802.3(GND) IC6803.3(GND) IC6804.3(GND) IC6805.7(P:GND) IC6807.7(P:GND) IC6808.3(GND) IC6809.3(GND) IC6811.2(GND) IC6811.3(GND) IC6811.4(GND) IC6812.2(GND) IC6812.3(GND) IC6812.4(GND) IC6814.7(P:GND) IC6815.3(GND) IC6820.3(GND) IC6821.3(GND) IC6827.7(P:GND) IC6828.7(P:GND) IC6829.7(P:GND) IC6830.3(GND) IC6831.7(P:GND) IC6832.7(P:GND) IC6833.3(GND) IC6834.7(P:GND) IC6835.3(GND) IC6836.7(P:GND) IC6837.3(GND) IC6847.7(P:GND) IC6848.7(P:GND) IC6849.7(P:GND) IC6850.7(P:GND) IC6851.7(P:GND) IC6852.7(P:GND) IC6853.3(GND) IC6865.7(P:GND) IC6866.7(P:GND) IC6867.7(P:GND) IC6868.3(GND) IC6869.7(P:GND) IC6870.7(P:GND) IC6871.3(GND) IC6872.7(P:GND) IC6873.3(GND) IC6874.3(GND)
VCC: IC1.14(P:VCC) IC2.14(P:VCC) IC3.14(P:VCC) IC4.14(P:VCC) IC5.14(P:VCC) IC7.14(P:VCC) IC9.14(P:VCC) IC10.14(P:VCC) IC12.14(P:VCC) IC13.14(P:VCC) IC14.14(P:VCC) IC15.14(P:VCC) IC16.14(P:VCC) IC17.14(P:VCC) IC19.14(P:VCC) IC20.14(P:VCC) IC21.14(P:VCC) IC22.14(P:VCC) IC23.14(P:VCC) IC26.14(P:VCC) IC27.14(P:VCC) IC28.14(P:VCC) IC30.14(P:VCC) IC31.14(P:VCC) IC32.14(P:VCC) IC33.14(P:VCC) IC34.14(P:VCC) IC35.14(P:VCC) IC36.14(P:VCC) IC37.14(P:VCC) IC39.14(P:VCC) IC41.5(VCC) IC42.14(P:VCC) IC43.14(P:VCC) IC44.5(VCC) IC45.5(VCC) IC46.5(VCC) IC47.5(VCC) IC48.5(VCC) IC49.5(VCC) IC50.5(VCC) IC51.14(P:VCC) IC52.8(VCC) IC53.14(P:VCC) IC54.14(P:VCC) IC55.14(P:VCC) IC57.14(P:VCC) IC58.14(P:VCC) IC59.14(P:VCC) IC60.14(P:VCC) IC61.14(P:VCC) IC63.14(P:VCC) IC64.14(P:VCC) IC66.14(P:VCC) IC68.5(VCC) IC69.5(VCC) IC70.5(VCC) IC71.5(VCC) IC72.5(VCC) IC74.14(P:VCC) IC76.14(P:VCC) IC77.5(VCC) IC78.14(P:VCC) IC79.5(VCC) IC80.14(P:VCC) IC81.5(VCC) IC82.14(P:VCC) IC83.5(VCC) IC84.14(P:VCC) IC85.5(VCC) IC86.5(VCC) IC87.5(VCC) IC88.5(VCC) IC89.5(VCC) IC90.5(VCC) IC91.5(VCC) IC92.5(VCC) IC93.5(VCC) IC94.5(VCC) IC95.5(VCC) IC96.5(VCC) IC97.5(VCC) IC98.5(VCC) IC99.5(VCC) IC100.5(VCC) IC101.5(VCC) IC102.5(VCC) IC103.14(P:VCC) IC106.14(P:VCC) IC109.14(P:VCC) IC110.5(VCC) IC111.14(P:VCC) IC112.5(VCC) IC113.5(VCC) IC114.14(P:VCC) IC115.5(VCC) IC116.5(VCC) IC117.14(P:VCC) IC118.5(VCC) IC119.14(P:VCC) IC120.5(VCC) IC121.14(P:VCC) IC122.5(VCC) IC123.14(P:VCC) IC124.14(P:VCC) IC125.14(P:VCC) IC126.5(VCC) IC127.14(P:VCC) IC130.14(P:VCC) IC131.5(VCC) IC133.5(VCC) IC141.14(P:VCC) IC144.5(VCC) IC153.5(VCC) IC154.5(VCC) IC155.14(P:VCC) IC157.5(VCC) IC158.5(VCC) IC159.5(VCC) IC160.5(VCC) IC161.5(VCC) IC162.14(P:VCC) IC163.5(VCC) IC164.14(P:VCC) IC165.5(VCC) IC166.14(P:VCC) IC167.5(VCC) IC169.14(P:VCC) IC189.14(P:VCC) IC190.14(P:VCC) IC198.14(P:VCC) IC5089.14(P:VCC) IC5183.14(P:VCC) IC5184.14(P:VCC) IC5185.14(P:VCC) IC5191.14(P:VCC) IC5196.14(P:VCC) IC5203.14(P:VCC) IC5206.5(VCC) IC5212.5(VCC) IC5217.14(P:VCC) IC5220.14(P:VCC) IC5231.14(P:VCC) IC5234.14(P:VCC) IC5240.14(P:VCC) IC5242.14(P:VCC) IC5247.14(P:VCC) IC5252.5(VCC) IC5257.5(VCC) IC5805.5(VCC) IC5808.5(VCC) IC5809.5(VCC) IC5810.14(P:VCC) IC5815.14(P:VCC) IC5847.5(VCC) IC5968.5(VCC) IC5991.5(VCC) IC6023.14(P:VCC) IC6043.14(P:VCC) IC6063.5(VCC) IC6075.5(VCC) IC6101.5(VCC) IC6102.5(VCC) IC6103.14(P:VCC) IC6105.14(P:VCC) IC6106.14(P:VCC) IC6107.14(P:VCC) IC6108.14(P:VCC) IC6109.5(VCC) IC6110.5(VCC) IC6111.14(P:VCC) IC6112.8(VCC) IC6113.14(P:VCC) IC6114.5(VCC) IC6115.14(P:VCC) IC6116.14(P:VCC) IC6125.14(P:VCC) IC6126.14(P:VCC) IC6127.14(P:VCC) IC6128.14(P:VCC) IC6129.14(P:VCC) IC6130.14(P:VCC) IC6131.14(P:VCC) IC6132.14(P:VCC) IC6134.14(P:VCC) IC6135.14(P:VCC) IC6140.14(P:VCC) IC6141.14(P:VCC) IC6142.14(P:VCC) IC6143.14(P:VCC) IC6144.14(P:VCC) IC6145.14(P:VCC) IC6146.14(P:VCC) IC6147.14(P:VCC) IC6148.5(VCC) IC6149.5(VCC) IC6153.14(P:VCC) IC6154.14(P:VCC) IC6155.14(P:VCC) IC6156.14(P:VCC) IC6165.14(P:VCC) IC6166.14(P:VCC) IC6167.14(P:VCC) IC6168.14(P:VCC) IC6169.5(VCC) IC6170.5(VCC) IC6171.14(P:VCC) IC6172.14(P:VCC) IC6173.14(P:VCC) IC6174.14(P:VCC) IC6175.14(P:VCC) IC6176.14(P:VCC) IC6177.14(P:VCC) IC6179.14(P:VCC) IC6180.14(P:VCC) IC6181.14(P:VCC) IC6182.14(P:VCC) IC6183.14(P:VCC) IC6184.14(P:VCC) IC6185.14(P:VCC) IC6186.14(P:VCC) IC6187.14(P:VCC) IC6188.5(VCC) IC6189.14(P:VCC) IC6190.14(P:VCC) IC6191.14(P:VCC) IC6192.14(P:VCC) IC6193.14(P:VCC) IC6195.14(P:VCC) IC6196.14(P:VCC) IC6198.14(P:VCC) IC6199.14(P:VCC) IC6200.14(P:VCC) IC6201.14(P:VCC) IC6202.14(P:VCC) IC6203.14(P:VCC) IC6204.14(P:VCC) IC6205.14(P:VCC) IC6206.14(P:VCC) IC6207.14(P:VCC) IC6208.14(P:VCC) IC6209.14(P:VCC) IC6211.14(P:VCC) IC6212.14(P:VCC) IC6214.14(P:VCC) IC6215.14(P:VCC) IC6216.14(P:VCC) IC6217.14(P:VCC) IC6218.14(P:VCC) IC6219.14(P:VCC) IC6220.14(P:VCC) IC6221.14(P:VCC) IC6222.5(VCC) IC6223.5(VCC) IC6224.14(P:VCC) IC6227.14(P:VCC) IC6228.14(P:VCC) IC6229.14(P:VCC) IC6230.14(P:VCC) IC6231.14(P:VCC) IC6232.14(P:VCC) IC6233.14(P:VCC) IC6234.14(P:VCC) IC6235.14(P:VCC) IC6236.5(VCC) IC6237.5(VCC) IC6238.5(VCC) IC6239.14(P:VCC) IC6240.14(P:VCC) IC6241.14(P:VCC) IC6242.14(P:VCC) IC6243.14(P:VCC) IC6244.14(P:VCC) IC6245.14(P:VCC) IC6246.5(VCC) IC6247.5(VCC) IC6248.5(VCC) IC6249.14(P:VCC) IC6250.14(P:VCC) IC6251.14(P:VCC) IC6252.14(P:VCC) IC6253.14(P:VCC) IC6254.14(P:VCC) IC6255.5(VCC) IC6256.14(P:VCC) IC6257.14(P:VCC) IC6258.14(P:VCC) IC6259.14(P:VCC) IC6260.14(P:VCC) IC6261.14(P:VCC) IC6262.14(P:VCC) IC6263.14(P:VCC) IC6265.5(VCC) IC6266.5(VCC) IC6267.8(VCC) IC6268.14(P:VCC) IC6269.14(P:VCC) IC6270.14(P:VCC) IC6272.5(VCC) IC6273.5(VCC) IC6274.14(P:VCC) IC6275.14(P:VCC) IC6276.14(P:VCC) IC6277.14(P:VCC) IC6279.14(P:VCC) IC6280.14(P:VCC) IC6281.14(P:VCC) IC6282.5(VCC) IC6284.14(P:VCC) IC6285.5(VCC) IC6286.14(P:VCC) IC6287.5(VCC) IC6288.5(VCC) IC6289.14(P:VCC) IC6290.5(VCC) IC6291.5(VCC) IC6292.5(VCC) IC6294.5(VCC) IC6295.5(VCC) IC6296.5(VCC) IC6297.5(VCC) IC6298.5(VCC) IC6299.8(VCC) IC6300.14(P:VCC) IC6301.8(VCC) IC6302.14(P:VCC) IC6303.8(VCC) IC6304.14(P:VCC) IC6305.8(VCC) IC6306.14(P:VCC) IC6307.14(P:VCC) IC6308.5(VCC) IC6309.14(P:VCC) IC6311.5(VCC) IC6312.14(P:VCC) IC6313.5(VCC) IC6314.8(VCC) IC6316.14(P:VCC) IC6317.14(P:VCC) IC6318.14(P:VCC) IC6319.14(P:VCC) IC6320.14(P:VCC) IC6321.14(P:VCC) IC6322.14(P:VCC) IC6323.14(P:VCC) IC6324.14(P:VCC) IC6325.14(P:VCC) IC6326.14(P:VCC) IC6328.14(P:VCC) IC6329.14(P:VCC) IC6330.14(P:VCC) IC6331.14(P:VCC) IC6332.5(VCC) IC6333.14(P:VCC) IC6334.5(VCC) IC6335.5(VCC) IC6336.5(VCC) IC6337.14(P:VCC) IC6338.5(VCC) IC6340.14(P:VCC) IC6341.14(P:VCC) IC6342.14(P:VCC) IC6343.5(VCC) IC6344.14(P:VCC) IC6345.5(VCC) IC6346.5(VCC) IC6347.5(VCC) IC6348.5(VCC) IC6349.5(VCC) IC6353.14(P:VCC) IC6354.5(VCC) IC6355.14(P:VCC) IC6356.14(P:VCC) IC6357.14(P:VCC) IC6358.5(VCC) IC6359.5(VCC) IC6365.14(P:VCC) IC6368.14(P:VCC) IC6370.5(VCC) IC6371.5(VCC) IC6372.5(VCC) IC6373.14(P:VCC) IC6380.14(P:VCC) IC6381.14(P:VCC) IC6382.14(P:VCC) IC6383.5(VCC) IC6387.14(P:VCC) IC6390.14(P:VCC) IC6391.14(P:VCC) IC6392.14(P:VCC) IC6393.14(P:VCC) IC6394.14(P:VCC) IC6395.5(VCC) IC6396.14(P:VCC) IC6397.14(P:VCC) IC6399.14(P:VCC) IC6400.14(P:VCC) IC6401.14(P:VCC) IC6402.14(P:VCC) IC6403.14(P:VCC) IC6404.14(P:VCC) IC6405.14(P:VCC) IC6406.14(P:VCC) IC6407.14(P:VCC) IC6408.14(P:VCC) IC6409.5(VCC) IC6410.14(P:VCC) IC6411.14(P:VCC) IC6412.5(VCC) IC6413.5(VCC) IC6414.14(P:VCC) IC6415.5(VCC) IC6416.14(P:VCC) IC6418.5(VCC) IC6419.14(P:VCC) IC6420.5(VCC) IC6421.14(P:VCC) IC6422.5(VCC) IC6423.5(VCC) IC6424.5(VCC) IC6425.5(VCC) IC6426.5(VCC) IC6427.5(VCC) IC6428.14(P:VCC) IC6429.14(P:VCC) IC6430.14(P:VCC) IC6431.14(P:VCC) IC6432.5(VCC) IC6433.5(VCC) IC6434.5(VCC) IC6435.5(VCC) IC6436.5(VCC) IC6437.5(VCC) IC6438.14(P:VCC) IC6439.14(P:VCC) IC6440.14(P:VCC) IC6441.14(P:VCC) IC6442.5(VCC) IC6443.5(VCC) IC6444.5(VCC) IC6445.5(VCC) IC6446.5(VCC) IC6447.14(P:VCC) IC6449.5(VCC) IC6450.14(P:VCC) IC6451.14(P:VCC) IC6452.5(VCC) IC6453.14(P:VCC) IC6454.5(VCC) IC6455.5(VCC) IC6456.5(VCC) IC6457.14(P:VCC) IC6458.14(P:VCC) IC6459.14(P:VCC) IC6460.14(P:VCC) IC6461.14(P:VCC) IC6462.14(P:VCC) IC6463.14(P:VCC) IC6464.14(P:VCC) IC6465.14(P:VCC) IC6466.14(P:VCC) IC6467.14(P:VCC) IC6468.14(P:VCC) IC6469.14(P:VCC) IC6470.5(VCC) IC6471.5(VCC) IC6472.5(VCC) IC6473.5(VCC) IC6474.5(VCC) IC6475.5(VCC) IC6476.5(VCC) IC6477.5(VCC) IC6478.14(P:VCC) IC6479.14(P:VCC) IC6480.5(VCC) IC6481.5(VCC) IC6482.5(VCC) IC6483.5(VCC) IC6484.14(P:VCC) IC6485.14(P:VCC) IC6493.14(P:VCC) IC6494.5(VCC) IC6507.5(VCC) IC6514.5(VCC) IC6515.14(P:VCC) IC6516.14(P:VCC) IC6520.14(P:VCC) IC6532.14(P:VCC) IC6536.5(VCC) IC6537.14(P:VCC) IC6538.14(P:VCC) IC6547.5(VCC) IC6548.5(VCC) IC6549.14(P:VCC) IC6550.5(VCC) IC6552.5(VCC) IC6553.14(P:VCC) IC6554.5(VCC) IC6555.5(VCC) IC6556.14(P:VCC) IC6557.5(VCC) IC6558.14(P:VCC) IC6559.5(VCC) IC6560.5(VCC) IC6561.14(P:VCC) IC6562.5(VCC) IC6567.14(P:VCC) IC6572.14(P:VCC) IC6573.14(P:VCC) IC6574.14(P:VCC) IC6575.14(P:VCC) IC6576.14(P:VCC) IC6579.14(P:VCC) IC6580.14(P:VCC) IC6581.14(P:VCC) IC6582.14(P:VCC) IC6584.14(P:VCC) IC6586.14(P:VCC) IC6587.14(P:VCC) IC6592.14(P:VCC) IC6593.14(P:VCC) IC6594.14(P:VCC) IC6596.14(P:VCC) IC6600.14(P:VCC) IC6602.14(P:VCC) IC6603.14(P:VCC) IC6607.5(VCC) IC6608.14(P:VCC) IC6612.14(P:VCC) IC6613.14(P:VCC) IC6614.14(P:VCC) IC6616.14(P:VCC) IC6617.14(P:VCC) IC6618.14(P:VCC) IC6620.14(P:VCC) IC6621.14(P:VCC) IC6622.14(P:VCC) IC6623.14(P:VCC) IC6626.5(VCC) IC6627.5(VCC) IC6628.5(VCC) IC6629.5(VCC) IC6630.5(VCC) IC6631.5(VCC) IC6632.5(VCC) IC6633.5(VCC) IC6634.5(VCC) IC6635.5(VCC) IC6636.14(P:VCC) IC6638.5(VCC) IC6642.14(P:VCC) IC6643.5(VCC) IC6644.5(VCC) IC6645.5(VCC) IC6646.5(VCC) IC6647.5(VCC) IC6648.5(VCC) IC6649.5(VCC) IC6650.5(VCC) IC6651.5(VCC) IC6652.5(VCC) IC6653.5(VCC) IC6655.5(VCC) IC6656.5(VCC) IC6657.5(VCC) IC6658.5(VCC) IC6665.14(P:VCC) IC6681.5(VCC) IC6682.5(VCC) IC6691.14(P:VCC) IC6706.14(P:VCC) IC6707.14(P:VCC) IC6719.8(VCC) IC6747.5(VCC) IC6748.14(P:VCC) IC6749.14(P:VCC) IC6750.14(P:VCC) IC6751.14(P:VCC) IC6752.14(P:VCC) IC6753.5(VCC) IC6754.14(P:VCC) IC6770.14(P:VCC) IC6779.5(VCC) IC6786.14(P:VCC) IC6787.14(P:VCC) IC6796.14(P:VCC) IC6797.14(P:VCC) IC6798.14(P:VCC) IC6799.14(P:VCC) IC6800.5(VCC) IC6801.5(VCC) IC6802.5(VCC) IC6803.5(VCC) IC6804.5(VCC) IC6805.14(P:VCC) IC6807.14(P:VCC) IC6808.5(VCC) IC6809.5(VCC) IC6811.8(VCC) IC6812.8(VCC) IC6814.14(P:VCC) IC6815.5(VCC) IC6820.5(VCC) IC6821.5(VCC) IC6827.14(P:VCC) IC6828.14(P:VCC) IC6829.14(P:VCC) IC6830.5(VCC) IC6831.14(P:VCC) IC6832.14(P:VCC) IC6833.5(VCC) IC6834.14(P:VCC) IC6835.5(VCC) IC6836.14(P:VCC) IC6837.5(VCC) IC6847.14(P:VCC) IC6848.14(P:VCC) IC6849.14(P:VCC) IC6850.14(P:VCC) IC6851.14(P:VCC) IC6852.14(P:VCC) IC6853.5(VCC) IC6865.14(P:VCC) IC6866.14(P:VCC) IC6867.14(P:VCC) IC6868.5(VCC) IC6869.14(P:VCC) IC6870.14(P:VCC) IC6871.5(VCC) IC6872.14(P:VCC) IC6873.5(VCC) IC6874.5(VCC)
VDD: IC6.14(P:VDD) IC8.14(VDD) IC11.14(P:VDD) IC18.14(P:VDD) IC24.14(VDD) IC25.14(P:VDD) IC29.14(P:VDD) IC38.14(VDD) IC40.14(VDD) IC56.14(P:VDD) IC62.14(VDD) IC65.14(P:VDD) IC67.14(P:VDD) IC73.14(P:VDD) IC75.14(P:VDD) IC104.14(P:VDD) IC105.14(P:VDD) IC107.14(P:VDD) IC108.14(P:VDD) IC156.14(P:VDD) IC5226.14(P:VDD) IC5804.14(P:VDD) IC6104.14(VDD) IC6152.14(P:VDD) IC6178.14(P:VDD) IC6194.14(P:VDD) IC6197.14(P:VDD) IC6210.14(P:VDD) IC6213.14(P:VDD) IC6225.14(P:VDD) IC6226.14(P:VDD) IC6271.14(P:VDD) IC6278.14(P:VDD) IC6327.14(P:VDD) IC6339.14(P:VDD) IC6350.14(P:VDD) IC6378.14(P:VDD) IC6379.14(P:VDD) IC6398.14(VDD) IC6417.14(P:VDD) IC6448.14(P:VDD) IC6517.14(P:VDD) IC6522.14(P:VDD) IC6523.14(P:VDD) IC6524.14(P:VDD) IC6546.14(P:VDD) IC6551.14(P:VDD) IC6563.14(VDD) IC6564.14(P:VDD) IC6565.14(P:VDD) IC6566.14(P:VDD) IC6568.14(P:VDD) IC6569.14(P:VDD) IC6570.14(VDD) IC6571.14(VDD) IC6619.14(P:VDD) IC6625.14(VDD) IC6659.14(P:VDD) IC6660.14(P:VDD) IC6661.14(P:VDD) IC6791.14(P:VDD) IC6806.14(P:VDD)
VSS: IC6.7(P:VSS) IC8.7(VSS) IC11.7(P:VSS) IC18.7(P:VSS) IC24.7(VSS) IC25.7(P:VSS) IC29.7(P:VSS) IC38.7(VSS) IC40.7(VSS) IC56.7(P:VSS) IC62.7(VSS) IC65.7(P:VSS) IC67.7(P:VSS) IC73.7(P:VSS) IC75.7(P:VSS) IC104.7(P:VSS) IC105.7(P:VSS) IC107.7(P:VSS) IC108.7(P:VSS) IC156.7(P:VSS) IC5226.7(P:VSS) IC5804.7(P:VSS) IC6104.7(VSS) IC6152.7(P:VSS) IC6178.7(P:VSS) IC6194.7(P:VSS) IC6197.7(P:VSS) IC6210.7(P:VSS) IC6213.7(P:VSS) IC6225.7(P:VSS) IC6226.7(P:VSS) IC6271.7(P:VSS) IC6278.7(P:VSS) IC6327.7(P:VSS) IC6339.7(P:VSS) IC6350.7(P:VSS) IC6378.7(P:VSS) IC6379.7(P:VSS) IC6398.7(VSS) IC6417.7(P:VSS) IC6448.7(P:VSS) IC6517.7(P:VSS) IC6522.7(P:VSS) IC6523.7(P:VSS) IC6524.7(P:VSS) IC6546.7(P:VSS) IC6551.7(P:VSS) IC6563.7(VSS) IC6564.7(P:VSS) IC6565.7(P:VSS) IC6566.7(P:VSS) IC6568.7(P:VSS) IC6569.7(P:VSS) IC6570.7(VSS) IC6571.7(VSS) IC6619.7(P:VSS) IC6625.7(VSS) IC6659.7(P:VSS) IC6660.7(P:VSS) IC6661.7(P:VSS) IC6791.7(P:VSS) IC6806.7(P:VSS)

## Library data of the parts
IC1 IC7 IC14 IC16 IC17 IC19 IC26 IC31 IC32 IC35 IC37 IC39 IC42 IC54 IC58 IC61 IC155 IC5196 IC5220 IC5231 IC5234 IC5242 IC5247 IC5815 IC6043 IC6105 IC6107 IC6108 IC6111 IC6132 IC6141 IC6154 IC6165 IC6171 IC6173 IC6180 IC6183 IC6193 IC6195 IC6196 IC6199 IC6201 IC6203-IC6205 IC6211 IC6212 IC6215 IC6217 IC6219 IC6221 IC6228 IC6231 IC6233 IC6235 IC6241 IC6243 IC6245 IC6250 IC6253 IC6257 IC6275 IC6284 IC6300 IC6318 IC6323 IC6324 IC6326 IC6331 IC6341 IC6397 IC6402 IC6411 IC6414 IC6421 IC6438 IC6459-IC6461 IC6463 IC6520 IC6538 IC6558 IC6576 IC6586 IC6587 IC6594 IC6603 IC6613 IC6622 IC6707 IC6832 IC6851 IC6870 = 74xx-eu:74*08: Quad 2-input AND gate
IC2 IC9 IC10 IC12 IC23 IC28 IC30 IC36 IC106 IC141 IC6140 IC6153 IC6156 IC6179 IC6182 IC6198 IC6200 IC6202 IC6214 IC6216 IC6218 IC6227 IC6230 IC6232 IC6234 IC6249 IC6256 IC6259 IC6260 IC6302 IC6307 IC6312 IC6321 IC6325 IC6328-IC6330 IC6340 IC6344 IC6356 IC6382 IC6391 IC6393 IC6396 IC6401 IC6403 IC6441 IC6556 IC6573-IC6575 IC6584 IC6596 IC6602 IC6621 IC6706 = 74xx-eu:74*32: Quad 2-input OR gate
IC3 IC51 IC6469 IC6600 = 74xx-eu:74*10: Triple 3-input NAND gate
IC4 IC6229 IC6276 IC6277 IC6404 IC6416 IC6467 = 74xx-eu:74*11: Triple 3-input AND gate
IC5 IC13 IC15 IC20-IC22 IC33 IC34 IC43 IC53 IC59 IC60 IC64 IC66 IC74 IC103 IC124 IC190 IC198 IC5089 IC5183-IC5185 IC5191 IC5810 IC6103 IC6130 IC6143 IC6145 IC6147 IC6175 IC6185 IC6187 IC6191 IC6206 IC6209 IC6252 IC6261-IC6263 IC6268 IC6281 IC6286 IC6304 IC6306 IC6309 IC6316 IC6319 IC6320 IC6322 IC6333 IC6342 IC6353 IC6373 IC6380 IC6387 IC6390 IC6394 IC6399 IC6405 IC6407 IC6419 IC6428 IC6429 IC6447 IC6450 IC6457 IC6458 IC6464 IC6465 IC6493 IC6515 IC6516 IC6532 IC6561 IC6567 IC6579-IC6582 IC6614 IC6616 IC6665 IC6691 IC6748-IC6751 IC6754 IC6798 IC6799 IC6805 IC6807 IC6827 IC6831 IC6834 IC6836 IC6847 IC6850 IC6852 IC6865 IC6869 IC6872 = 74xx-eu:74*04: Hex INVERTER
IC6 IC11 IC25 IC67 IC6152 IC6178 IC6271 IC6417 IC6619 = 40xx:4002: 4-input NOR
IC8 IC24 IC38 IC40 IC62 IC6104 IC6398 IC6563 IC6570 IC6571 IC6625 = 40xx:4078: 8-input NOR
IC18 IC73 IC75 IC104 IC107 IC5804 IC6194 IC6197 IC6210 IC6213 IC6225 IC6226 IC6278 IC6350 IC6378 IC6448 IC6517 IC6522-IC6524 IC6546 IC6551 IC6564-IC6566 IC6568 IC6569 IC6659 IC6791 IC6806 = 40xx:4072: Dual 4-input OR
IC27 IC5203 IC5240 IC6269 IC6270 IC6408 IC6462 IC6592 IC6617 = 74xx-eu:74*27: Triple 3-input NOR gate
IC29 IC56 IC65 IC105 IC108 IC156 IC5226 IC6327 IC6339 IC6379 IC6660 IC6661 = 40xx:4075: Triple 3-input OR
IC41 IC44-IC50 IC68-IC72 IC77 IC79 IC81 IC83 IC85-IC102 IC110 IC112 IC113 IC115 IC116 IC118 IC120 IC122 IC126 IC131 IC133 IC144 IC153 IC154 IC157-IC161 IC163 IC165 IC167 IC5206 IC5212 IC5252 IC5257 IC5805 IC5808 IC5809 IC5847 IC5968 IC5991 IC6063 IC6075 IC6101 IC6102 IC6109 IC6110 IC6114 IC6148 IC6149 IC6169 IC6170 IC6188 IC6222 IC6223 IC6236-IC6238 IC6246-IC6248 IC6255 IC6265 IC6266 IC6272 IC6273 IC6282 IC6285 IC6287 IC6288 IC6290-IC6292 IC6294-IC6298 IC6308 IC6311 IC6313 IC6332 IC6334-IC6336 IC6338 IC6343 IC6345-IC6349 IC6354 IC6358 IC6359 IC6370-IC6372 IC6383 IC6395 IC6409 IC6412 IC6413 IC6415 IC6418 IC6420 IC6422-IC6427 IC6432-IC6437 IC6442-IC6446 IC6449 IC6452 IC6454-IC6456 IC6470-IC6477 IC6480-IC6483 IC6494 IC6507 IC6514 IC6536 IC6547 IC6548 IC6550 IC6552 IC6554 IC6555 IC6557 IC6559 IC6560 IC6562 IC6607 IC6626-IC6635 IC6638 IC6643-IC6653 IC6655-IC6658 IC6681 IC6682 IC6747 IC6753 IC6779 IC6800-IC6804 IC6808 IC6809 IC6815 IC6820 IC6821 IC6830 IC6833 IC6835 IC6837 IC6853 IC6868 IC6871 IC6873 IC6874 = DM1:74*1G373
IC52 IC6112 IC6267 IC6299 IC6301 IC6303 IC6305 IC6314 IC6719 IC6811 IC6812 = DM1:SPDT
IC55 IC63 IC6146 IC6168 IC6172 IC6177 IC6186 IC6357 IC6381 IC6451 IC6620 IC6770 = 74xx-eu:74*00: Quad 2-input NAND gate
IC57 IC76 IC78 IC80 IC82 IC84 IC109 IC111 IC114 IC117 IC119 IC121 IC125 IC127 IC162 IC164 IC166 IC169 IC189 IC5217 IC6023 IC6106 IC6113 IC6131 IC6142 IC6144 IC6155 IC6166 IC6174 IC6176 IC6181 IC6184 IC6189 IC6190 IC6192 IC6207 IC6208 IC6220 IC6224 IC6242 IC6244 IC6251 IC6274 IC6289 IC6337 IC6392 IC6400 IC6406 IC6410 IC6430 IC6431 IC6439 IC6440 IC6537 IC6549 IC6553 IC6572 IC6593 IC6618 IC6623 IC6752 IC6796 IC6797 = 74xx-eu:74*02: Quad 2-input NOR gate
IC123 IC130 IC6355 IC6484 IC6485 IC6642 IC6786 IC6814 = 74xx-eu:74*125: Quad bus BUFFER, 3-state
IC128 IC129 IC132 IC138-IC140 IC142 IC143 IC145-IC152 IC172-IC188 IC191-IC194 IC5090 IC5091 IC5113-IC5115 IC5137-IC5139 IC5186 IC6117-IC6124 IC6133 IC6136-IC6139 IC6150 IC6151 IC6157-IC6164 IC6283 IC6293 IC6310 IC6315 IC6351 IC6352 IC6360-IC6364 IC6366 IC6367 IC6369 IC6374-IC6377 IC6384-IC6386 IC6388 IC6389 IC6486-IC6492 IC6495-IC6506 IC6508-IC6513 IC6518 IC6519 IC6521 IC6525-IC6531 IC6533-IC6535 IC6539-IC6545 IC6577 IC6578 IC6583 IC6585 IC6609-IC6611 IC6637 IC6639-IC6641 IC6654 IC6662-IC6664 IC6742-IC6746 IC6755-IC6769 IC6771-IC6775 IC6789 IC6813 IC6816-IC6819 IC6822-IC6826 IC6838-IC6846 IC6855-IC6864 = DM1:MAX4613
IC6115 IC6125 IC6128 IC6828 IC6848 IC6866 = 74xx-eu:74*01: Quad 2-input NAND gate, open collector
IC6116 IC6135 = 74xx-eu:74*136: Quad EXCLUSIVE-OR (XOR) gate, open collector
IC6126 IC6129 = 74xx-eu:74*33: Quad 2-input NOR buffer, open collector
IC6127 IC6134 IC6167 IC6478 IC6612 IC6829 IC6849 IC6867 = 74xx-eu:74*05: Hex INVERTER, open collector
IC6239 IC6240 IC6254 IC6258 IC6279 IC6280 IC6453 IC6608 IC6787 = 74xx-eu:74*86: Quad 2-input EXCLUSIVE-OR (XOR) gate
IC6317 IC6365 IC6368 IC6479 IC6636 = 74xx-eu:74*07: Hex BUFFER, open collector high-voltage output
IC6466 IC6468 = 74xx-eu:74*21: Dual 4-input AND gate
R1 R3-R9 R1332-R1379 R1381 R1383-R1389 R1391-R1395 R1397 R1398 R1401-R1405 R1407 R1408 = resistor:R-EU_: RESISTOR, European symbol